# Altium project umay.PrjPcb
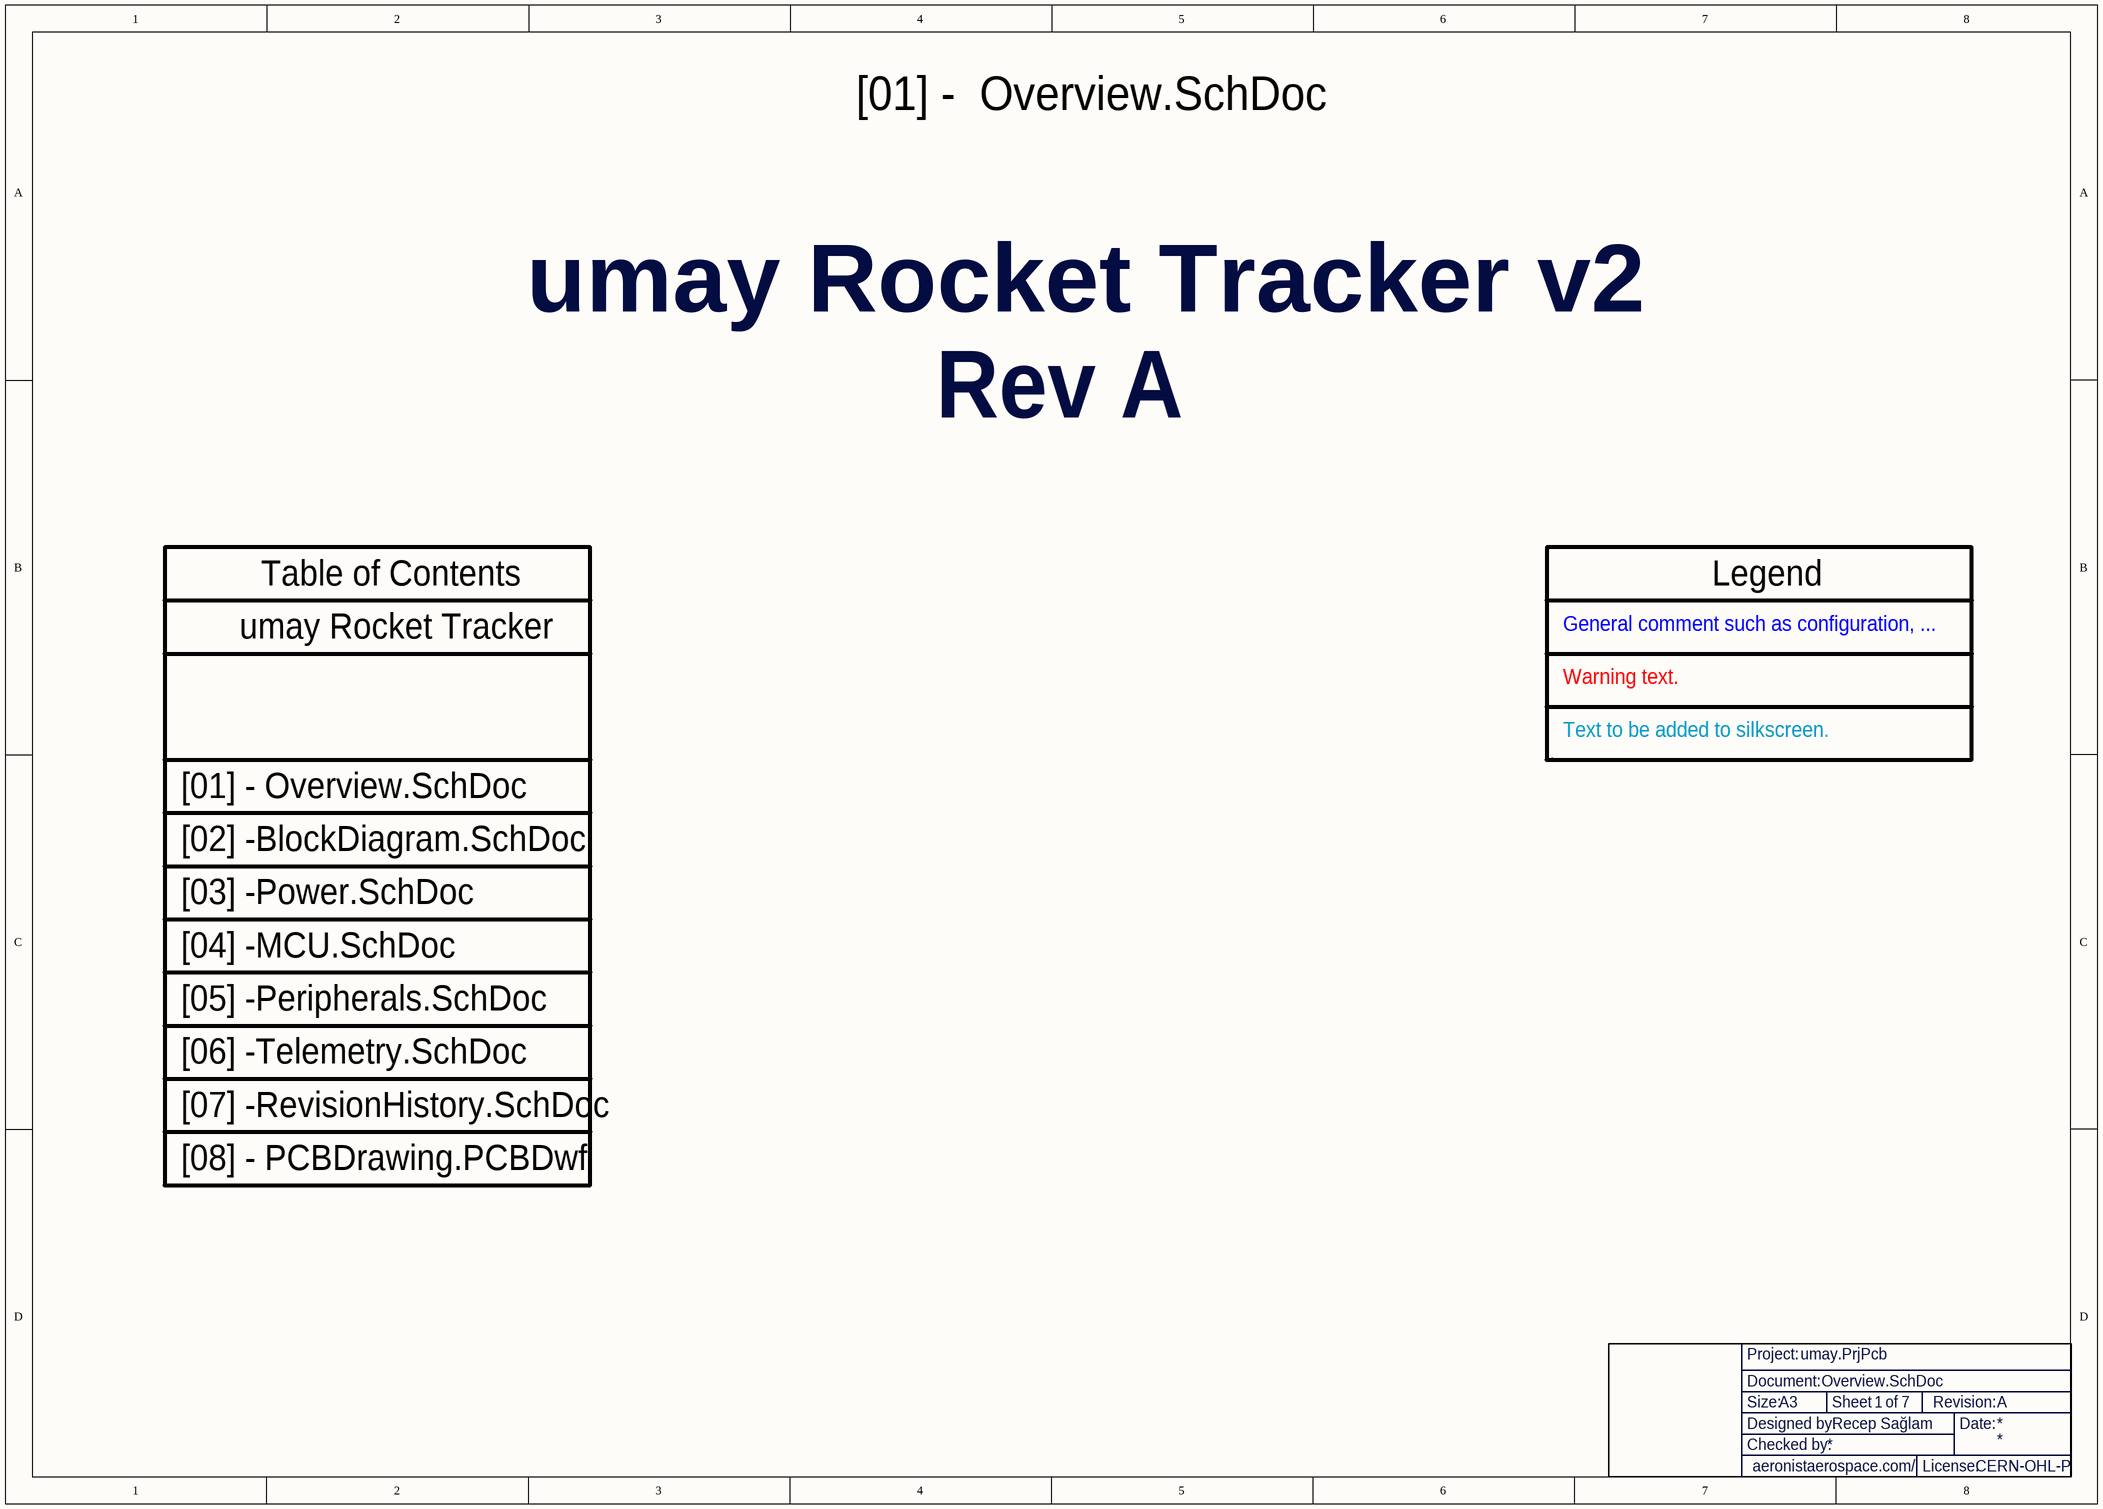
[diagram p0: Overview.SchDoc]
DesignedBy: Recep Sağlam; License: CERN-OHL-P; Revision: A; Size: A3
7 sheets, 115 parts. Net scope: flat (ports and power ports of the same name join across sheets).
Board file: umay.PcbDoc
Sheets:
  Overview.SchDoc
    MCU = MCU.SchDoc
    Peripherals = Peripherals.SchDoc
    Power = Power.SchDoc
    Telemetry = Telemetry.SchDoc
    Designator = BlockDiagram.SchDoc
    Designator = RevisionHistory.SchDoc

## Sheet Overview.SchDoc
size A3; SheetNumber: 1; SheetTotal: 7

### Parts
(Parts that share a designator on the sheet are numbered #1, #2 ... from top to bottom, then left to right.)
?#1  Title Block  (value not drawn)  (graphical)

### Sub-sheets
Designator = BlockDiagram.SchDoc: no entries
Designator = RevisionHistory.SchDoc: no entries
MCU = MCU.SchDoc: no entries
Peripherals = Peripherals.SchDoc: no entries
Power = Power.SchDoc: no entries
Telemetry = Telemetry.SchDoc: no entries

### Notes on the sheet
- [01] -  Overview.SchDoc
- umay Rocket Tracker v2
- Rev A
- umay Rocket Tracker
- Table of Contents
- General comment such as configuration, ...
- Legend
- Warning text.
- Text to be added to silkscreen.
- [01] - Overview.SchDoc
- [02] -
- [03] -
- [04] -
- [05] -
- [06] -
- [07] -
- [08] - PCBDrawing.PCBDwf
- (in symbol Title Block) Project:; Document:; Size:; Sheet; of; Revision:; Designed by:; Date:; Checked by:; aeronistaerospace.com/; License:

## Sheet MCU.SchDoc
size A3; SheetNumber: 4; SheetTotal: 7
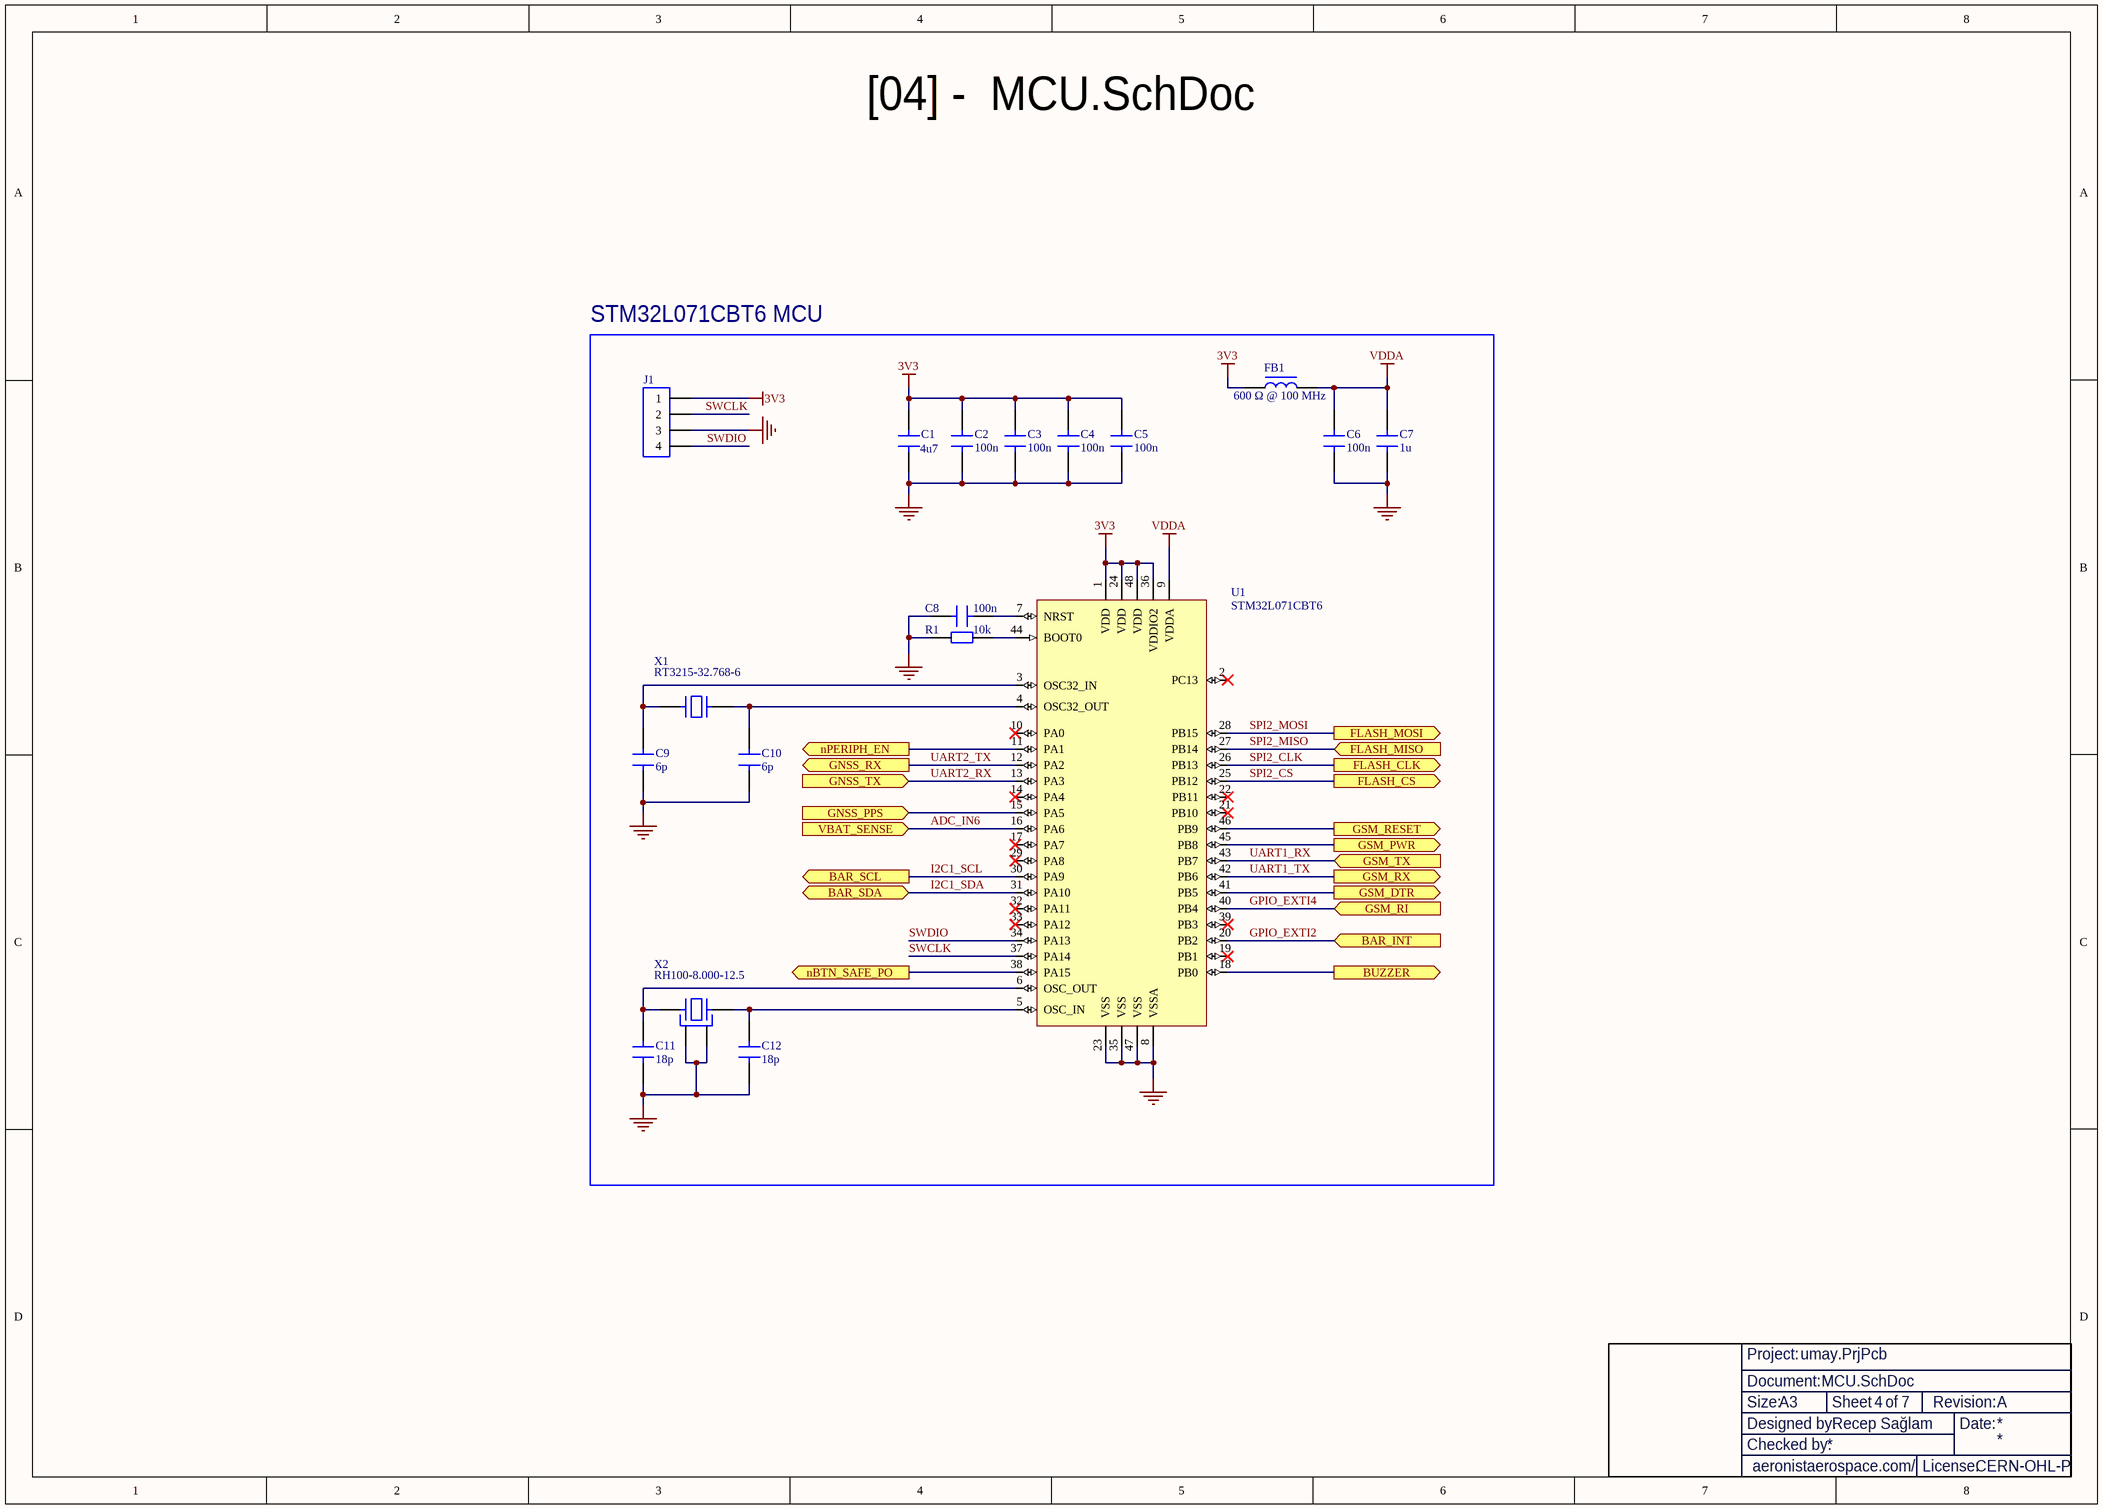
[diagram p1: MCU.SchDoc]

### Parts
(Parts that share a designator on the sheet are numbered #1, #2 ... from top to bottom, then left to right.)
?#2  Title Block  (value not drawn)  (graphical)
C1  4u7  [CAP 0603]
C2  100n  [CAP 0402]
C3  100n  [CAP 0402]
C4  100n  [CAP 0402]
C5  100n  [CAP 0402]
C6  100n  [CAP 0402]
C7  1u  [CAP 0603]
C8  100n  [CAP 0402]
C9  6p  [CAP 0402]
C10  6p  [CAP 0402]
C11  18p  [CAP 0402]
C12  18p  [CAP 0402]
FB1  600 Ω @ 100 MHz  [FB 0402]
J1  CONN 1x4 Pad 1.27mm  [CONN 1x4 PAD 1.27mm]  (value not drawn)
R1  10k  [RES 0402]
U1  STM32L071CBT6  [LQFP48]
X1  RT3215-32.768-6  [RT3215-32.768-X]
X2  RH100-8.000-12.5  [RH100]

### Blocks framed on the sheet
STM32L071CBT6 MCU: C1-C12 FB1 J1 R1 U1 X1 X2

### Ports
BAR_INT (in, see Peripherals[2C]), BAR_SCL (out, see Peripherals[4C]), BAR_SDA (bidir, see Peripherals[4C]), BUZZER (out, see Peripherals[5C]), FLASH_CLK (out, see Peripherals[5B]), FLASH_CS (out, see Peripherals[5B]), FLASH_MISO (in, see Peripherals[5B]), FLASH_MOSI (out, see Peripherals[5B]), GNSS_PPS (in, see Peripherals[3B]), GNSS_RX (out, see Peripherals[3B]), GNSS_TX (in, see Peripherals[3B]), GSM_DTR (out, see Telemetry[5D]), GSM_PWR (out, see Telemetry[5B]), GSM_RESET (out, see Telemetry[5C]), GSM_RI (in, see Telemetry[5D]), GSM_RX (out, see Telemetry[5D]), GSM_TX (in, see Telemetry[5D]), nBTN_SAFE_PO (out, see Telemetry[4C]), nPERIPH_EN (out, see Power[7C]), VBAT_SENSE (in, see Power[5C])

### Nets
3V3: C1.2 C2.2 C3.2 C4.2 C5.2 FB1.2 J1.1 U1.1(VDD) U1.24(VDD) U1.36(VDDIO2) U1.48(VDD)
GND: C1.1 C2.1 C3.1 C4.1 C5.1 C6.1 C7.1 C8.2 C9.1 C10.1 C11.1 C12.1 J1.3 R1.2 U1.8(VSSA) U1.23(VSS) U1.35(VSS) U1.47(VSS) X2.2(GND) X2.4(GND)
VDDA: C6.2 C7.2 FB1.1 U1.9(VDDA)
ADC_IN6: U1.16(PA6) ; port VBAT_SENSE
GNSS_PPS: U1.15(PA5) ; port GNSS_PPS
GPIO_EXTI2: U1.20(PB2) ; port BAR_INT
GPIO_EXTI4: U1.40(PB4) ; port GSM_RI
I2C1_SCL: U1.30(PA9) ; port BAR_SCL
I2C1_SDA: U1.31(PA10) ; port BAR_SDA
SPI2_CLK: U1.26(PB13) ; port FLASH_CLK
SPI2_CS: U1.25(PB12) ; port FLASH_CS
SPI2_MISO: U1.27(PB14) ; port FLASH_MISO
SPI2_MOSI: U1.28(PB15) ; port FLASH_MOSI
SWCLK: J1.2 U1.37(PA14)
SWDIO: J1.4 U1.34(PA13)
UART1_RX: U1.43(PB7) ; port GSM_TX
UART1_TX: U1.42(PB6) ; port GSM_RX
UART2_RX: U1.13(PA3) ; port GNSS_TX
UART2_TX: U1.12(PA2) ; port GNSS_RX
NetC8_1: C8.1 U1.7(NRST)
NetC9_2: C9.2 U1.3(OSC32_IN) X1.1
NetC10_2: C10.2 U1.4(OSC32_OUT) X1.2
NetC11_2: C11.2 U1.6(OSC_OUT) X2.1
NetC12_2: C12.2 U1.5(OSC_IN) X2.3
NetC13_1: U1.38(PA15) ; port nBTN_SAFE_PO
NetR1_1: R1.1 U1.44(BOOT0)
NetR7_2: U1.18(PB0) ; port BUZZER
NetR16_2: U1.45(PB8) ; port GSM_PWR
NetR19_2: U1.46(PB9) ; port GSM_RESET
NetR28_1: U1.11(PA1) ; port nPERIPH_EN
NetU1_41: U1.41(PB5) ; port GSM_DTR

Not connected (* = marked no-connect by the designer): U1 2(PC13)* 10(PA0)* 14(PA4)* 17(PA7)* 19(PB1)* 21(PB10)* 22(PB11)* 29(PA8)* 32(PA11)* 33(PA12)* 39(PB3)*

### Notes on the sheet
- [04] -  MCU.SchDoc
- (in symbol Title Block) Project:; Document:; Size:; Sheet; of; Revision:; Designed by:; Date:; Checked by:; aeronistaerospace.com/; License:

### Library data of the parts
C1 C7 = CAP 0603: Capacitor SMD 0603
C2-C6 C8-C12 = CAP 0402: Capacitor SMD 0402
FB1 = FB 0402: Ferrite Bead SMD 0402
J1 = CONN 1x4 Pad 1.27mm: 1×4 pin header connector, 1.27 mm pitch.
R1 = RES 0402: Resistor SMD 0402
U1 = STM32L071CBT6: MCU 32-Bit Ultra Low Power STM32L ARM Cortex M0+ RISC 128kB Flash 48-Pin LQFP Tray; Manufacturer: STMicroelectronics; Core Architecture: ARM Cortex-M0+; Data Bus Width: 32b; EEPROM Memory Size: 6kB; Frequency: 32MHz; Interface: I2S; Max Junction Temperature (Tj): 105°C; Max Power Dissipation: 370mW; Max Supply Voltage: 3.6V; Min Supply Voltage: 1.65V; Nominal Supply Current: 290nA; Number of A/D Converters: 1; Number of ADC Channels: 13; Number of Channels: 10; Number of I2C Channels: 2; Number of I/Os: 37; Number of PWM Channels: 4; Number of Timers/Counters: 8; Operating Supply Voltage: 3V; Peripherals: POR; RAM Size: 20kB; Watchdog Timer: Yes; Supplier: Farnell; Supplier Part Number: 2518142; Manufacturer Part Number: STM32L071CBT6; RoHS: Compliant; Category: Microcontrollers; Stock: 10105; Pricing: 1=3,31, 10=2,59, 25=2,41, 50=2,29, 100=2,07, 250=1,97, 500=1,9, 1000=1,74 (EUR); Ambient Temperature Range High: 85°C; Case/Package: LQFP; China RoHS: Compliant; Flash Memory Size: 128kB; Height: 1.6mm; Height - Seated (Max): 1.6mm; Lead Free: Lead Free; Length: 7mm; Lifecycle Status: Production; Clock Frequency: 32MHz; Max Operating Temperature: 85°C; Memory Size: 128kB; Memory Format: FLASH; Min Operating Temperature: -40°C; Mounting Technology: Surface Mount; Pins: 48; Number of Programmable I/O: 37; Number of SPI Channels: 2; Number of Terminals: 48; Number of UART Channels: 1; Number of USART Channels: 4; REACH SVHC: Yes; Schedule B: 8542310000; Terminal Pitch: 500µm; Width: 7mm; ComponentLink1URL: https://datasheet.octopart.com:443/STM32L071CBT6-STMicroelectronics-datasheet-137481386.pdf?src-supplier=IHS; ComponentLink1Description: https://datasheet.octopart.com:443/STM32L071CBT6-STMicroelectronics-datasheet-137481386.pdf?src-supplier=IHS; ComponentLink2URL: https://datasheet.octopart.com:443/STM32L071CBT6-STMicroelectronics-datasheet-113139635.pdf?src-supplier=ODG+(Origin+Data+Global); ComponentLink2Description: https://datasheet.octopart.com:443/STM32L071CBT6-STMicroelectronics-datasheet-113139635.pdf?src-supplier=ODG+(Origin+Data+Global); ComponentLink3URL: https://datasheet.octopart.com:443/STM32L071CBT6-STMicroelectronics-datasheet-62336796.pdf?src-supplier=SHENGYU+ELECTRONICS; ComponentLink3Description: https://datasheet.octopart.com:443/STM32L071CBT6-STMicroelectronics-datasheet-62336796.pdf?src-supplier=SHENGYU+ELECTRONICS; ComponentLink4URL: https://datasheet.octopart.com:443/STM32L071CBT6-STMicroelectronics-datasheet-49624918.pdf?src-supplier=Newark; ComponentLink4Description: https://datasheet.octopart.com:443/STM32L071CBT6-STMicroelectronics-datasheet-49624918.pdf?src-supplier=Newark
X1 = RT3215-32.768-X: Parallel - Fundamental Quartz Crystal, 0.032768MHz Nom; Manufacturer: Raltron Electronics; Manufacturer Part Number: RT3215-32.768-12.5-TR; Manufacturer Lifecycle Status: ACTIVE; Value: 12.5pF; Frequency: 32.768kHz; Frequency Stability: 144ppm; Frequency Tolerance: 0.002%; ESR: 70kΩ; Supplier: Arrow Electronics; Supplier Part Number: RT3215-32.768-12.5-TR; RoHS: Compliant; Category: Crystals; Stock: 108000; Pricing: 3000=0,2828, 6000=0,28, 9000=0,276, 15000=0,188, 21000=0,154, 30000=0,152 (USD); China RoHS: Compliant; Lead Free: Lead Free; Lifecycle Status: Production; Load Capacitance: 12.5pF; Max Operating Temperature: 85°C; Min Operating Temperature: -40°C; Mounting Technology: Surface Mount; REACH SVHC: Yes; Schedule B: 8541600080, 8541600080|8541600080|8541600080|8541600080|8541600080; Tolerance: 0.002%; ComponentLink1URL: https://datasheet.octopart.com:443/RT3215-32.768-12.5-TR-Raltron-Electronics-datasheet-181182521.pdf?src-supplier=IHS; ComponentLink1Description: https://datasheet.octopart.com:443/RT3215-32.768-12.5-TR-Raltron-Electronics-datasheet-181182521.pdf?src-supplier=IHS; ComponentLink2URL: https://datasheet.octopart.com:443/RT3215-32.768-12.5-TR-Raltron-Electronics-datasheet-140255155.pdf?src-supplier=Raltron+Electronics; ComponentLink2Description: https://datasheet.octopart.com:443/RT3215-32.768-12.5-TR-Raltron-Electronics-datasheet-140255155.pdf?src-supplier=Raltron+Electronics; ComponentLink3URL: https://datasheet.octopart.com:443/RT3215-32.768-12.5-TR-Raltron-Electronics-datasheet-137126748.pdf?src-supplier=Future+Electronics; ComponentLink3Description: https://datasheet.octopart.com:443/RT3215-32.768-12.5-TR-Raltron-Electronics-datasheet-137126748.pdf?src-supplier=Future+Electronics; ComponentLink4URL: https://datasheet.octopart.com:443/RT3215-32.768-12.5-TR-Raltron-Electronics-datasheet-82614827.pdf?src-supplier=Future+Electronics; ComponentLink4Description: https://datasheet.octopart.com:443/RT3215-32.768-12.5-TR-Raltron-Electronics-datasheet-82614827.pdf?src-supplier=Future+Electronics; ComponentLink5URL: https://datasheet.octopart.com:443/RT3215-32.768-12.5-TR-Raltron-Electronics-datasheet-62112304.pdf?src-supplier=Future+Electronics; ComponentLink5Description: https://datasheet.octopart.com:443/RT3215-32.768-12.5-TR-Raltron-Electronics-datasheet-62112304.pdf?src-supplier=Future+Electronics; ComponentLink6URL: https://datasheet.octopart.com:443/RT3215-32.768-12.5-TR-Raltron-Electronics-datasheet-12522443.pdf?src-supplier=Future+Electronics; ComponentLink6Description: https://datasheet.octopart.com:443/RT3215-32.768-12.5-TR-Raltron-Electronics-datasheet-12522443.pdf?src-supplier=Future+Electronics
X2 = RH100-X-X: RH100 Series Crystal, X Mhz, X pF, Smd, 3.2Mm X 2.5Mm Raltron

## Sheet Peripherals.SchDoc
size A3; SheetNumber: 5; SheetTotal: 7
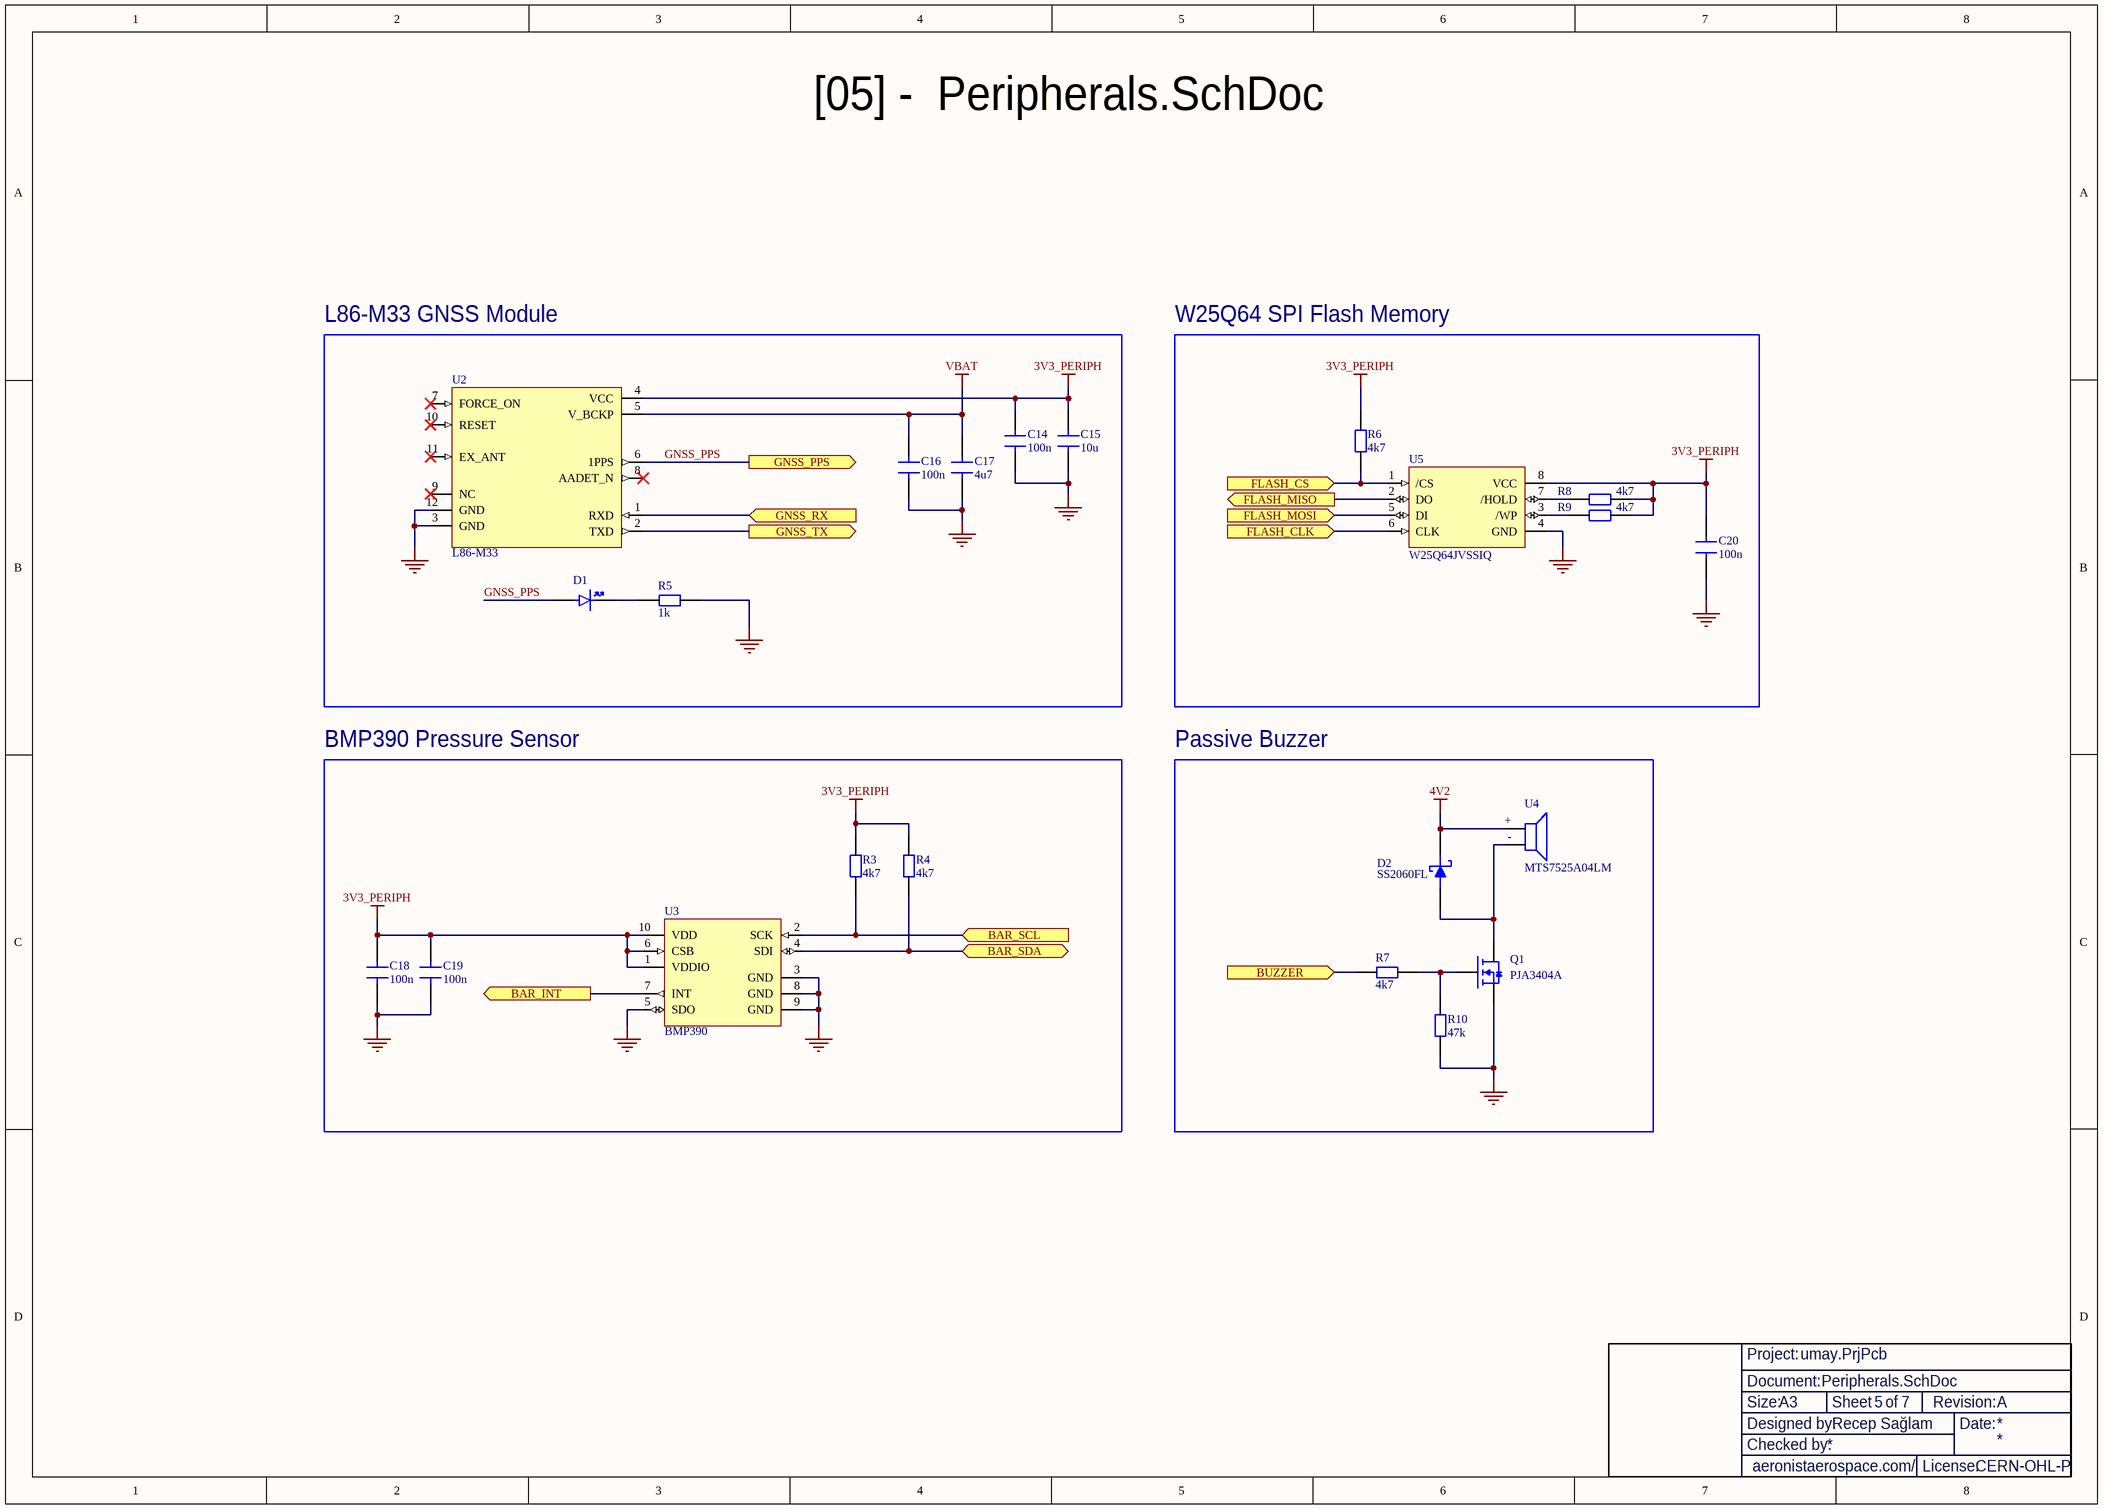
[diagram p2: Peripherals.SchDoc]

### Parts
(Parts that share a designator on the sheet are numbered #1, #2 ... from top to bottom, then left to right.)
?#3  Title Block  (value not drawn)  (graphical)
C14  100n  [CAP 0402]
C15  10u  [CAP 0603]
C16  100n  [CAP 0402]
C17  4u7  [CAP 0603]
C18  100n  [CAP 0402]
C19  100n  [CAP 0402]
C20  100n  [CAP 0402]
D1  LED 0805  [LED 0805]  (value not drawn)
D2  SS2060FL  [SOD-123FL]
Q1  PJA3404A  [SOT23-3]
R3  4k7  [RES 0402]
R4  4k7  [RES 0402]
R5  1k  [RES 0402]
R6  4k7  [RES 0402]
R7  4k7  [RES 0402]
R8  4k7  [RES 0402]
R9  4k7  [RES 0402]
R10  47k  [RES 0402]
U2  L86-M33  [L86-M33]
U3  BMP390  [BMP390]
U4  MTS7525A04LM  [MTS7525A04LM]
U5  W25Q64JVSSIQ  [SOP-8]

### Blocks framed on the sheet
L86-M33 GNSS Module: C14-C17 D1 R5 U2
W25Q64 SPI Flash Memory: C20 R6 R8 R9 U5
BMP390 Pressure Sensor: C18 C19 R3 R4 U3
Passive Buzzer: D2 Q1 R7 R10 U4

### Ports
BAR_INT (out, see MCU[6C]), BAR_SCL (in, see MCU[4C]), BAR_SDA (bidir, see MCU[4C]), BUZZER (in, see MCU[6C]), FLASH_CLK (in, see MCU[6C]), FLASH_CS (in, see MCU[6C]), FLASH_MISO (out, see MCU[6B]), FLASH_MOSI (in, see MCU[6B]), GNSS_PPS (out, see MCU[4C]), GNSS_RX (in, see MCU[4C]), GNSS_TX (out, see MCU[4C])

### Nets
3V3_PERIPH: C14.2 C15.2 C18.2 C19.2 C20.2 R3.2 R4.2 R6.1 R8.2 R9.2 U2.4(VCC) U3.1(VDDIO) U3.6(CSB) U3.10(VDD) U5.8(VCC)
4V2: D2.2 U4.+
GND: C14.1 C15.1 C16.1 C17.1 C18.1 C19.1 C20.1 Q1.2(S) R5.2 R10.1 U2.3(GND) U2.12(GND) U3.3(GND) U3.5(SDO) U3.8(GND) U3.9(GND) U5.4(GND)
VBAT: C16.2 C17.2 U2.5(V_BCKP)
GNSS_PPS: D1.A U2.6(1PPS) ; port GNSS_PPS
GPIO_EXTI2: U3.7(INT) ; port BAR_INT
I2C1_SCL: R3.1 U3.2(SCK) ; port BAR_SCL
I2C1_SDA: R4.1 U3.4(SDI) ; port BAR_SDA
SPI2_CLK: U5.6(CLK) ; port FLASH_CLK
SPI2_CS: R6.2 U5.1(/CS) ; port FLASH_CS
SPI2_MISO: U5.2(DO) ; port FLASH_MISO
SPI2_MOSI: U5.5(DI) ; port FLASH_MOSI
UART2_RX: U2.2(TXD) ; port GNSS_TX
UART2_TX: U2.1(RXD) ; port GNSS_RX
NetD1_K: D1.K R5.1
NetD2_1: D2.1 Q1.3(D) U4.-
NetQ1_1: Q1.1(G) R7.1 R10.2
NetR7_2: R7.2 ; port BUZZER
NetR8_1: R8.1 U5.7(/HOLD)
NetR9_1: R9.1 U5.3(/WP)

Not connected (* = marked no-connect by the designer): U2 7(FORCE_ON)* 8(AADET_N)* 9(NC)* 10(RESET)* 11(EX_ANT)*

### Notes on the sheet
- [05] -  Peripherals.SchDoc
- (in symbol Title Block) Project:; Document:; Size:; Sheet; of; Revision:; Designed by:; Date:; Checked by:; aeronistaerospace.com/; License:

### Library data of the parts
C14 C16 C18-C20 = CAP 0402: Capacitor SMD 0402
C15 C17 = CAP 0603: Capacitor SMD 0603
D1 = LED 0805: LED 0805 SMD
D2 = SS2060FL: Rectifier Diode, Schottky, 1 Phase, 1 Element, 2A, 60V V(RRM), Silicon; Manufacturer: Panjit; Manufacturer Part Number: SS2060FL_R1_00001; Element Configuration: Single; Forward Voltage: 700mV; Max Forward Surge Current (Ifsm): 50A; Number of Elements: 1; Peak Reverse Current: 40µA; Supplier: Mouser; Supplier Part Number: 241-SS2060FLR100001; RoHS: Compliant; Category: Rectifier Diodes; Stock: 5102; Pricing: 1=0,36, 10=0,232, 50=0,232, 100=0,161, 1000=0,107, 10000=0,067 (USD); Lifecycle Status: Production; Max Operating Temperature: 150°C; Max Output current: 2A; Max Repetitive Reverse Voltage (Vrrm): 60V; Min Operating Temperature: -50°C; Mounting Technology: Surface Mount; Pins: 2; Number of Terminals: 2; Peak Non-Repetitive Surge Current: 50A; Radiation Hardening: No; REACH SVHC: No; Reverse Standoff Voltage: 60V; ComponentLink1URL: https://datasheet.octopart.com:443/SS2060FL_R1_00001-Panjit-datasheet-151294498.pdf?src-supplier=IHS; ComponentLink1Description: https://datasheet.octopart.com:443/SS2060FL_R1_00001-Panjit-datasheet-151294498.pdf?src-supplier=IHS; ComponentLink2URL: https://datasheet.octopart.com:443/SS2060FL_R1_00001-Panjit-datasheet-180983485.pdf?src-supplier=IHS; ComponentLink2Description: https://datasheet.octopart.com:443/SS2060FL_R1_00001-Panjit-datasheet-180983485.pdf?src-supplier=IHS
Q1 = MOSFET N-CH: SOT-23-3 package, N-Channel MOSFET
R3-R10 = RES 0402: Resistor SMD 0402
U2 = L86-M33: GNSS Module, Galileo, GLONASS, GPS, QZSS, 1.57542GHz, 1.60171GHz, -167 dBm, 35 s, 3V to 4.3V; Manufacturer: Quectel; Number of Circuits: 1; Operating Supply Voltage: 3.3V; Supplier: Mouser; Supplier Part Number: 277-L86-M33; Manufacturer Part Number: L86-M33; RoHS: Compliant; Category: RF Transceiver Modules and Modems; Stock: 1427; Pricing: 1=12,82, 10=11,15, 50=10,56, 100=9,77, 1000=8,75, 10000=8,75 (USD); Height - Seated (Max): 7.15mm; Length: 18.4mm; Max Operating Temperature: 85°C; Min Operating Temperature: -40°C; Number of Terminals: 12; REACH SVHC: Yes; Width: 18.4mm; ComponentLink1URL: https://datasheet.octopart.com:443/L86-M33-Quectel-datasheet-181153375.pdf?src-supplier=IHS; ComponentLink1Description: https://datasheet.octopart.com:443/L86-M33-Quectel-datasheet-181153375.pdf?src-supplier=IHS; ComponentLink2URL: https://datasheet.octopart.com:443/L86-M33-Quectel-datasheet-163887215.pdf?src-supplier=SOS+electronic; ComponentLink2Description: https://datasheet.octopart.com:443/L86-M33-Quectel-datasheet-163887215.pdf?src-supplier=SOS+electronic; ComponentLink3URL: https://datasheet.octopart.com/L86-M33-Quectel-datasheet-77840748.pdf; ComponentLink3Description: https://datasheet.octopart.com/L86-M33-Quectel-datasheet-77840748.pdf
U3 = BMP390: Pressure sensor, 300-1250hPa, 2.0*2.0*0.75mm, I2C/SPI; Manufacturer: Bosch Sensortec; Supplier: Future Electronics; Supplier Part Number: 3151950; Manufacturer Part Number: BMP390; RoHS: Compliant; Category: Pressure Sensors; Stock: 106; Pricing: 1=3,29, 20=3,01, 150=2,83, 1000=2,65, 5000=2,5 (USD); ComponentLink1URL: https://datasheet.octopart.com:443/BMP390-Bosch-Sensortec-datasheet-164327956.pdf?src-supplier=Future+Electronics; ComponentLink1Description: https://datasheet.octopart.com:443/BMP390-Bosch-Sensortec-datasheet-164327956.pdf?src-supplier=Future+Electronics
U4 = MTS7525A04LM: 7.5 x 7.5 mm magnetic passive buzzer, SMT, 3.6 V (2.5–4.5 V), 2.7 kHz, 85 dB.
U5 = W25Q64JVSSIQ: NOR Flash Serial (SPI, Dual SPI, Quad SPI) 3V/3.3V 64M-bit 8M x 8 6ns 8-Pin SOIC T/R/Tray/Tube; Manufacturer: Winbond; Address Bus Width: 24b; Density: 512Mb; Frequency: 133MHz; Max Supply Current: 18mA; Max Supply Voltage: 3.6V; Memory Size: 8MB; Min Supply Voltage: 2.7V; Number of Circuits: 1; Operating Supply Voltage: 3V; Page Size: 256B; Supplier: Arrow Electronics; Supplier Part Number: W25Q64JVSSIQ; Manufacturer Part Number: W25Q64JVSSIQ; RoHS: Compliant; Category: Flash; Stock: 305; Pricing: 90=0,8058, 180=0,804, 270=0,785 (USD); Access Time: 6ns; Ambient Temperature Range High: 85°C; Case/Package: SOIC; China RoHS: Compliant; Height: 2.16mm; Height - Seated (Max): 2.16mm; Interface: Serial; Length: 5.23mm; Lifecycle Status: Production; Clock Frequency: 133MHz; Max Operating Temperature: 85°C; Memory Format: FLASH; Min Operating Temperature: -40°C; Mounting Technology: Surface Mount; Pins: 8; Number of Terminals: 8; REACH SVHC: Yes; Schedule B: 8542320070, 8542320070|8542320070, 8542320070|8542320070|8542320070, 8542320070|8542320070|8542320070|8542320070; Terminal Pitch: 1.27mm; Width: 5.23mm; ComponentLink1URL: https://datasheet.octopart.com:443/W25Q64JVSSIQ-Winbond-datasheet-179437472.pdf?src-supplier=IHS; ComponentLink1Description: https://datasheet.octopart.com:443/W25Q64JVSSIQ-Winbond-datasheet-179437472.pdf?src-supplier=IHS; ComponentLink2URL: https://datasheet.octopart.com:443/W25Q64JVSSIQ-Winbond-datasheet-138898694.pdf?src-supplier=ODG+(Origin+Data+Global); ComponentLink2Description: https://datasheet.octopart.com:443/W25Q64JVSSIQ-Winbond-datasheet-138898694.pdf?src-supplier=ODG+(Origin+Data+Global); ComponentLink3URL: https://sigma.octopart.com:443/138898685/technical_drawing/Winbond-W25Q64JVSSIQ.pdf?src-supplier=Upverter; ComponentLink3Description: https://sigma.octopart.com:443/138898685/technical_drawing/Winbond-W25Q64JVSSIQ.pdf?src-supplier=Upverter

## Sheet Power.SchDoc
size A3; SheetNumber: 3; SheetTotal: 7
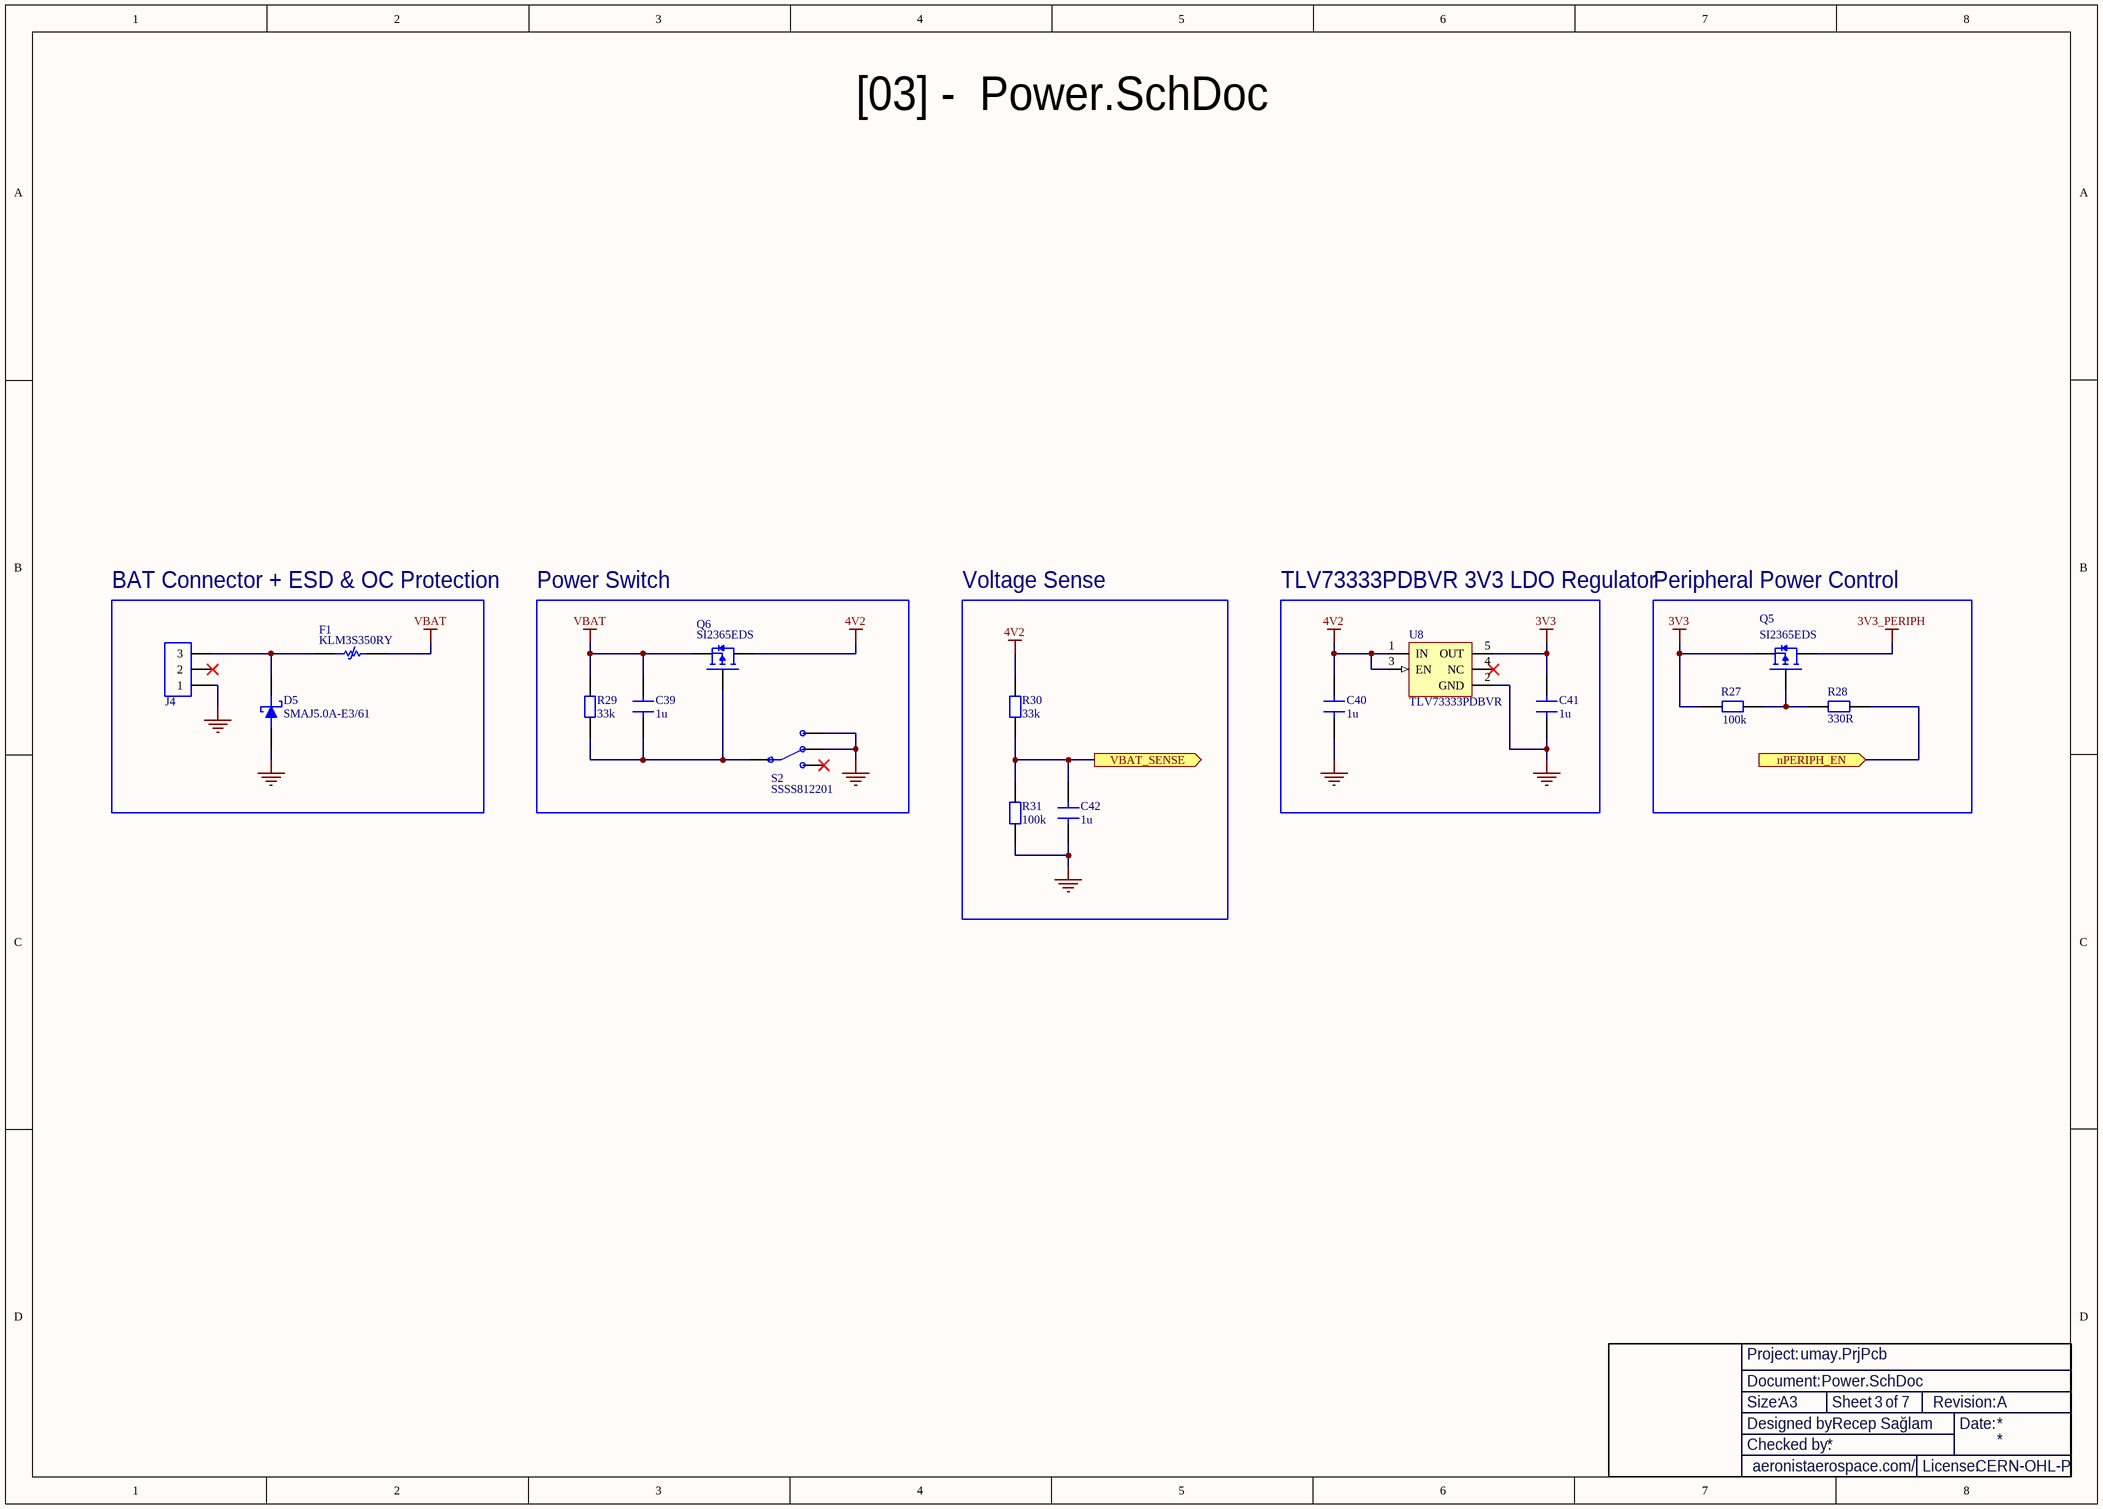
[diagram p3: Power.SchDoc]

### Parts
(Parts that share a designator on the sheet are numbered #1, #2 ... from top to bottom, then left to right.)
?#4  Title Block  (value not drawn)  (graphical)
C39  1u  [CAP 0603]
C40  1u  [CAP 0603]
C41  1u  [CAP 0603]
C42  1u  [CAP 0603]
D5  SMAJ5.0A-E3/61  [SMA]
F1  KLM3S350RY  [PTC 1206]
J4  CONN 1x3 Micro Fit 3.00mm  [CONN 1X3 MICRO-FIT 3.00MM]  (value not drawn)
Q5  SI2365EDS  [SOT23-3]
Q6  SI2365EDS  [SOT23-3]
R27  100k  [RES 0402]
R28  330R  [RES 0402]
R29  33k  [RES 0402]
R30  33k  [RES 0402]
R31  100k  [RES 0402]
S2  SSSS812201  [SSSS812201]
U8  TLV73333PDBVR  [SOT23-5]

### Blocks framed on the sheet
BAT Connector + ESD & OC Protection: D5 F1 J4
Power Switch: C39 Q6 R29 S2
Voltage Sense: C42 R30 R31
TLV73333PDBVR 3V3 LDO Regulator: C40 C41 U8
Peripheral Power Control: Q5 R27 R28

### Ports
nPERIPH_EN (in, see MCU[4B]), VBAT_SENSE (out, see MCU[4C])

### Nets
3V3: C41.2 Q5.2(S) R27.2 U8.5(OUT)
3V3_PERIPH: Q5.3(D)
4V2: C40.2 Q6.3(D) R30.2 U8.1(IN) U8.3(EN)
GND: C40.1 C41.1 C42.1 D5.1 J4.1 R31.1 S2.1(NO) S2.2(NC) U8.2(GND)
VBAT: C39.2 F1.2 Q6.2(S) R29.2
ADC_IN6: C42.2 R30.1 R31.2 ; port VBAT_SENSE
NetC39_1: C39.1 Q6.1(G) R29.1 S2.3(C)
NetD5_2: D5.2 F1.1 J4.3
NetQ5_1: Q5.1(G) R27.1 R28.2
NetR28_1: R28.1 ; port nPERIPH_EN

Not connected (* = marked no-connect by the designer): J4 2*; S2 4(NO)*; U8 4(NC)*

### Notes on the sheet
- [03] -  Power.SchDoc
- (in symbol Title Block) Project:; Document:; Size:; Sheet; of; Revision:; Designed by:; Date:; Checked by:; aeronistaerospace.com/; License:

### Library data of the parts
C39-C42 = CAP 0603: Capacitor SMD 0603
D5 = SMAJ-X: SMAJ Series SMT Bi/Uni-Directional Transient Voltage Suppressor - SMA
F1 = PTC 1206: PTC Resettable Fuse; Manufacturer: Bel; Manufacturer Part Number: 0ZCG0075FF2C; Max Current Rating: 100A; Hold Current: 750mA; Trip Current: 1.5A; Time to Trip: 200ms; Supplier 1: Arrow Electronics; RoHS: Yes; Category: PTC Resettable Fuses; Stock 1: 4661; Pricing 1: 2000=0,0751, 4000=0,0699, 6000=0,065, 10000=0,0604 (USD); Mount: Surface Mount; Case/Package: 1812; Case Code (Metric): 4532; Case Code (Imperial): 1812; Contact Plating: Tin,Matte; Min Operating Temperature: -40°C; Max Operating Temperature: 85°C; Packaging: Cut Tape; Series: 0ZCG; Lead Free: Lead Free; RoHS Compliant: Yes; ComponentLink1URL: https://datasheet.ciiva.com/18550/0zcg-18550523.pdf?src-supplier=Digi-Key; ComponentLink1Description: https://datasheet.ciiva.com/18550/0zcg-18550523.pdf?src-supplier=Digi-Key; ComponentLink2URL: https://datasheet.ciiva.com/18550/0zcg-18550524.pdf?src-supplier=Digi-Key; ComponentLink2Description: https://datasheet.ciiva.com/18550/0zcg-18550524.pdf?src-supplier=Digi-Key; ComponentLink3URL: https://datasheet.ciiva.com/18550/0zcg-18550767.pdf?src-supplier=Digi-Key; ComponentLink3Description: https://datasheet.ciiva.com/18550/0zcg-18550767.pdf?src-supplier=Digi-Key
J4 = CONN 1x3 Micro Fit 3.00mm: 1×2 Micro Fit type connector, 3.0 mm pitch, surface-mount.
Q5 Q6 = MOSFET P-CH: SOT-23-3 package, P-Channel MOSFET
R27-R31 = RES 0402: Resistor SMD 0402
S2 = SSSS812201: Slide Switch / Switch Slide SP3T Side Slide 0.3A 5VDC 10000Cycles Gull Wing SMD T/R; Manufacturer: ALPS; Actuator Length: 1.4986mm; Contact Current Rating: 300mA; Contact Resistance: 70mΩ; Electrical Life: 10kcycles; Illumination Type: Non-Illuminated; Insulation Resistance: 100MΩ; Max Voltage Rating (DC): 4V; Number of Positions: 3; Operating Force: 2N; Voltage Rating (DC): 5V; Supplier: Mouser; Supplier Part Number: 688-SSSS812201; Manufacturer Part Number: SSSS812201; RoHS: Compliant; Category: Slide Switches; Stock: 3543; Pricing: 1=1,77, 10=1,6, 50=1,47, 100=1,34, 1000=0,852, 10000=0,851 (USD); Current Rating: 300mA; Depth: 5mm; Export Control Classification Number (ECCN) Code: EAR99; Height: 1.4mm; Harmonized Tariff Schedule (HTS) Code: 8536.50.90.50; Introduction Date: 2010-02-04; Length: 9.7mm; Lifecycle Status: Production; Max Current Rating: 300mA; Max Operating Temperature: 85°C; Mechanical Life: 10kcycles; Min Operating Temperature: -40°C; Mounting Technology: Surface Mount; Pins: 3; Orientation: Right Angle; Radiation Hardening: No; Termination: Gull Wing; Throw Configuration: SP3T; ComponentLink1URL: https://datasheet.octopart.com:443/SSSS812201-ALPS-datasheet-182235029.pdf?src-supplier=IHS; ComponentLink1Description: https://datasheet.octopart.com:443/SSSS812201-ALPS-datasheet-182235029.pdf?src-supplier=IHS; ComponentLink2URL: https://datasheet.octopart.com:443/SSSS812201-ALPS-datasheet-182235643.pdf?src-supplier=IHS; ComponentLink2Description: https://datasheet.octopart.com:443/SSSS812201-ALPS-datasheet-182235643.pdf?src-supplier=IHS; ComponentLink3URL: https://datasheet.octopart.com:443/SSSS812201-ALPS-datasheet-154726925.pdf?src-supplier=Electro+Sonic; ComponentLink3Description: https://datasheet.octopart.com:443/SSSS812201-ALPS-datasheet-154726925.pdf?src-supplier=Electro+Sonic; ComponentLink4URL: https://datasheet.octopart.com:443/SSSS812201-ALPS-datasheet-41175121.pdf?src-supplier=Electro+Sonic; ComponentLink4Description: https://datasheet.octopart.com:443/SSSS812201-ALPS-datasheet-41175121.pdf?src-supplier=Electro+Sonic; ComponentLink5URL: https://datasheet.octopart.com:443/SSSS812201-ALPS-datasheet-37145305.pdf?src-supplier=Electro+Sonic; ComponentLink5Description: https://datasheet.octopart.com:443/SSSS812201-ALPS-datasheet-37145305.pdf?src-supplier=Electro+Sonic; ComponentLink6URL: https://datasheet.octopart.com:443/SSSS812201-ALPS-datasheet-140497758.pdf?src-supplier=TME; ComponentLink6Description: https://datasheet.octopart.com:443/SSSS812201-ALPS-datasheet-140497758.pdf?src-supplier=TME
U8 = TLV73333PDBVR: 300-mA, capacitor-free, low-IQ, low-dropout voltage regulator with enable 5-SOT-23 -40 to 125; Manufacturer: Texas Instruments; Manufacturer Lifecycle Status: ACTIVE; Accuracy: 1%; Dropout Voltage: 125mV; Max Supply Voltage: 5.5V; Max Junction Temperature (Tj): 125°C; Max Output current: 300mA; Min Current Limit: 360mA; Min Input Voltage: 1.4V; Nominal Supply Current: 34µA; Number of Channels: 1; Output Type: Fixed; Output Voltage: 3.3V; Polarity: Positive; Quiescent Current: 60µA; Supplier: Mouser; Supplier Part Number: 595-TLV73333PDBVR; Manufacturer Part Number: TLV73333PDBVR; RoHS: Compliant; Category: LDO Voltage Regulators; Stock: 12067; Pricing: 1=0,17, 10=0,115, 50=0,101, 100=0,086, 1000=0,07, 10000=0,062 (USD); Case/Package: SOT-23; Contact Plating: Gold; Height: 1.45mm; Lead Free: Lead Free; Length: 2.9mm; Lifecycle Status: Production; Max Operating Temperature: 125°C; Min Operating Temperature: -40°C; Min Supply Voltage: 1.4V; Mounting Technology: Surface Mount; Number of Outputs: 1; Pins: 5; Number of Regulators: 1; Output Current: 300mA; Packaging: Tape & Reel; Radiation Hardening: No; Schedule B: 8542390000, 8542390000|8542390000|8542390000|8542390000|8542390000; Thickness: 1.2mm; Weight: 15.790684mg; Width: 1.6mm; ComponentLink1URL: https://sigma.octopart.com:443/177332311/technical_drawing/Texas-Instruments-TLV73333PDBVR.pdf?src-supplier=Texas+Instruments; ComponentLink1Description: https://sigma.octopart.com:443/177332311/technical_drawing/Texas-Instruments-TLV73333PDBVR.pdf?src-supplier=Texas+Instruments; ComponentLink2URL: https://octopart.com:443/opatz8j6/c1?t=30rxbCOKURE0fvLotVHr2--9yC-4hWgg0fjorl7QajC5RXkKBG22M4ZWLOTtqEVkHrkQWGSvUBCT4JzFCKRza57xxEH2AM5zMdrmzUF7HUn0SZ7VrBnq1qaBEhnASKZ9K6cpMGD6K96mHw2RuAXFnqi8r3hf25pr5WVy_93zC9DtrJ2-QNFvwlrZk1EXJAO4qYO9518NXgqDx2DdBm28by8vGuJzgOvU8mXkfRtT8k19nHvP1ZfIaADJPU6FeaqlEbd-j24xmPfxYt-FfVEHWXt0tW1yZYApp5WPtqSvL-aKGKcx1420oXKrzNb7imis-_kE6QqMT633l-x_OdY6nHSWd6_HrFJGfkvfwlphIUbgO9Y3y8pg3cXI5t7uujLqBDPZRvw&src-supplier=Texas+Instruments; ComponentLink2Description: https://octopart.com:443/opatz8j6/c1?t=30rxbCOKURE0fvLotVHr2--9yC-4hWgg0fjorl7QajC5RXkKBG22M4ZWLOTtqEVkHrkQWGSvUBCT4JzFCKRza57xxEH2AM5zMdrmzUF7HUn0SZ7VrBnq1qaBEhnASKZ9K6cpMGD6K96mHw2RuAXFnqi8r3hf25pr5WVy_93zC9DtrJ2-QNFvwlrZk1EXJAO4qYO9518NXgqDx2DdBm28by8vGuJzgOvU8mXkfRtT8k19nHvP1ZfIaADJPU6FeaqlEbd-j24xmPfxYt-FfVEHWXt0tW1yZYApp5WPtqSvL-aKGKcx1420oXKrzNb7imis-_kE6QqMT633l-x_OdY6nHSWd6_HrFJGfkvfwlphIUbgO9Y3y8pg3cXI5t7uujLqBDPZRvw&src-supplier=Texas+Instruments; ComponentLink3URL: https://sigma.octopart.com:443/175570406/technical_drawing/Texas-Instruments-TLV73333PDBVR.pdf?src-supplier=Texas+Instruments; ComponentLink3Description: https://sigma.octopart.com:443/175570406/technical_drawing/Texas-Instruments-TLV73333PDBVR.pdf?src-supplier=Texas+Instruments; ComponentLink4URL: https://sigma.octopart.com:443/169406034/technical_drawing/Texas-Instruments-TLV73333PDBVR.pdf?src-supplier=Texas+Instruments; ComponentLink4Description: https://sigma.octopart.com:443/169406034/technical_drawing/Texas-Instruments-TLV73333PDBVR.pdf?src-supplier=Texas+Instruments; ComponentLink5URL: https://sigma.octopart.com:443/155939316/technical_drawing/Texas-Instruments-TLV73333PDBVR.pdf?src-supplier=Texas+Instruments; ComponentLink5Description: https://sigma.octopart.com:443/155939316/technical_drawing/Texas-Instruments-TLV73333PDBVR.pdf?src-supplier=Texas+Instruments; ComponentLink6URL: https://sigma.octopart.com:443/102331370/technical_drawing/Texas-Instruments-TLV73333PDBVR.pdf?src-supplier=Texas+Instruments; ComponentLink6Description: https://sigma.octopart.com:443/102331370/technical_drawing/Texas-Instruments-TLV73333PDBVR.pdf?src-supplier=Texas+Instruments; ComponentLink7URL: https://datasheet.octopart.com:443/TLV73333PDBVR-Texas-Instruments-datasheet-37736395.pdf?src-supplier=Texas+Instruments; ComponentLink7Description: https://datasheet.octopart.com:443/TLV73333PDBVR-Texas-Instruments-datasheet-37736395.pdf?src-supplier=Texas+Instruments; ComponentLink8URL: https://datasheet.octopart.com:443/TLV73333PDBVR-Texas-Instruments-datasheet-34151877.pdf?src-supplier=Texas+Instruments; ComponentLink8Description: https://datasheet.octopart.com:443/TLV73333PDBVR-Texas-Instruments-datasheet-34151877.pdf?src-supplier=Texas+Instruments; ComponentLink9URL: https://sigma.octopart.com:443/49249325/technical_drawing/Texas-Instruments-TLV73333PDBVR.pdf?src-supplier=Texas+Instruments; ComponentLink9Description: https://sigma.octopart.com:443/49249325/technical_drawing/Texas-Instruments-TLV73333PDBVR.pdf?src-supplier=Texas+Instruments; ComponentLink10URL: https://datasheet.octopart.com:443/TLV73333PDBVR-Texas-Instruments-datasheet-32043788.pdf?src-supplier=Texas+Instruments; ComponentLink10Description: https://datasheet.octopart.com:443/TLV73333PDBVR-Texas-Instruments-datasheet-32043788.pdf?src-supplier=Texas+Instruments; ComponentLink11URL: https://datasheet.octopart.com:443/TLV73333PDBVR-Texas-Instruments-datasheet-159114894.pdf?src-supplier=Augswan; ComponentLink11Description: https://datasheet.octopart.com:443/TLV73333PDBVR-Texas-Instruments-datasheet-159114894.pdf?src-supplier=Augswan; ComponentLink12URL: https://datasheet.octopart.com:443/TLV73333PDBVR-Texas-Instruments-datasheet-159117831.pdf?src-supplier=LCSC; ComponentLink12Description: https://datasheet.octopart.com:443/TLV73333PDBVR-Texas-Instruments-datasheet-159117831.pdf?src-supplier=LCSC; ComponentLink13URL: http://sigma.octopart.com:80/conflict_mineral_statement/Texas-Instruments-company-63.pdf?src-supplier=Compliance+Statements; ComponentLink13Description: http://sigma.octopart.com:80/conflict_mineral_statement/Texas-Instruments-company-63.pdf?src-supplier=Compliance+Statements; ComponentLink14URL: http://sigma.octopart.com:80/reach_statement/Texas-Instruments-company-64.pdf?src-supplier=Compliance+Statements; ComponentLink14Description: http://sigma.octopart.com:80/reach_statement/Texas-Instruments-company-64.pdf?src-supplier=Compliance+Statements

## Sheet Telemetry.SchDoc
size A3; SheetNumber: 6; SheetTotal: 7
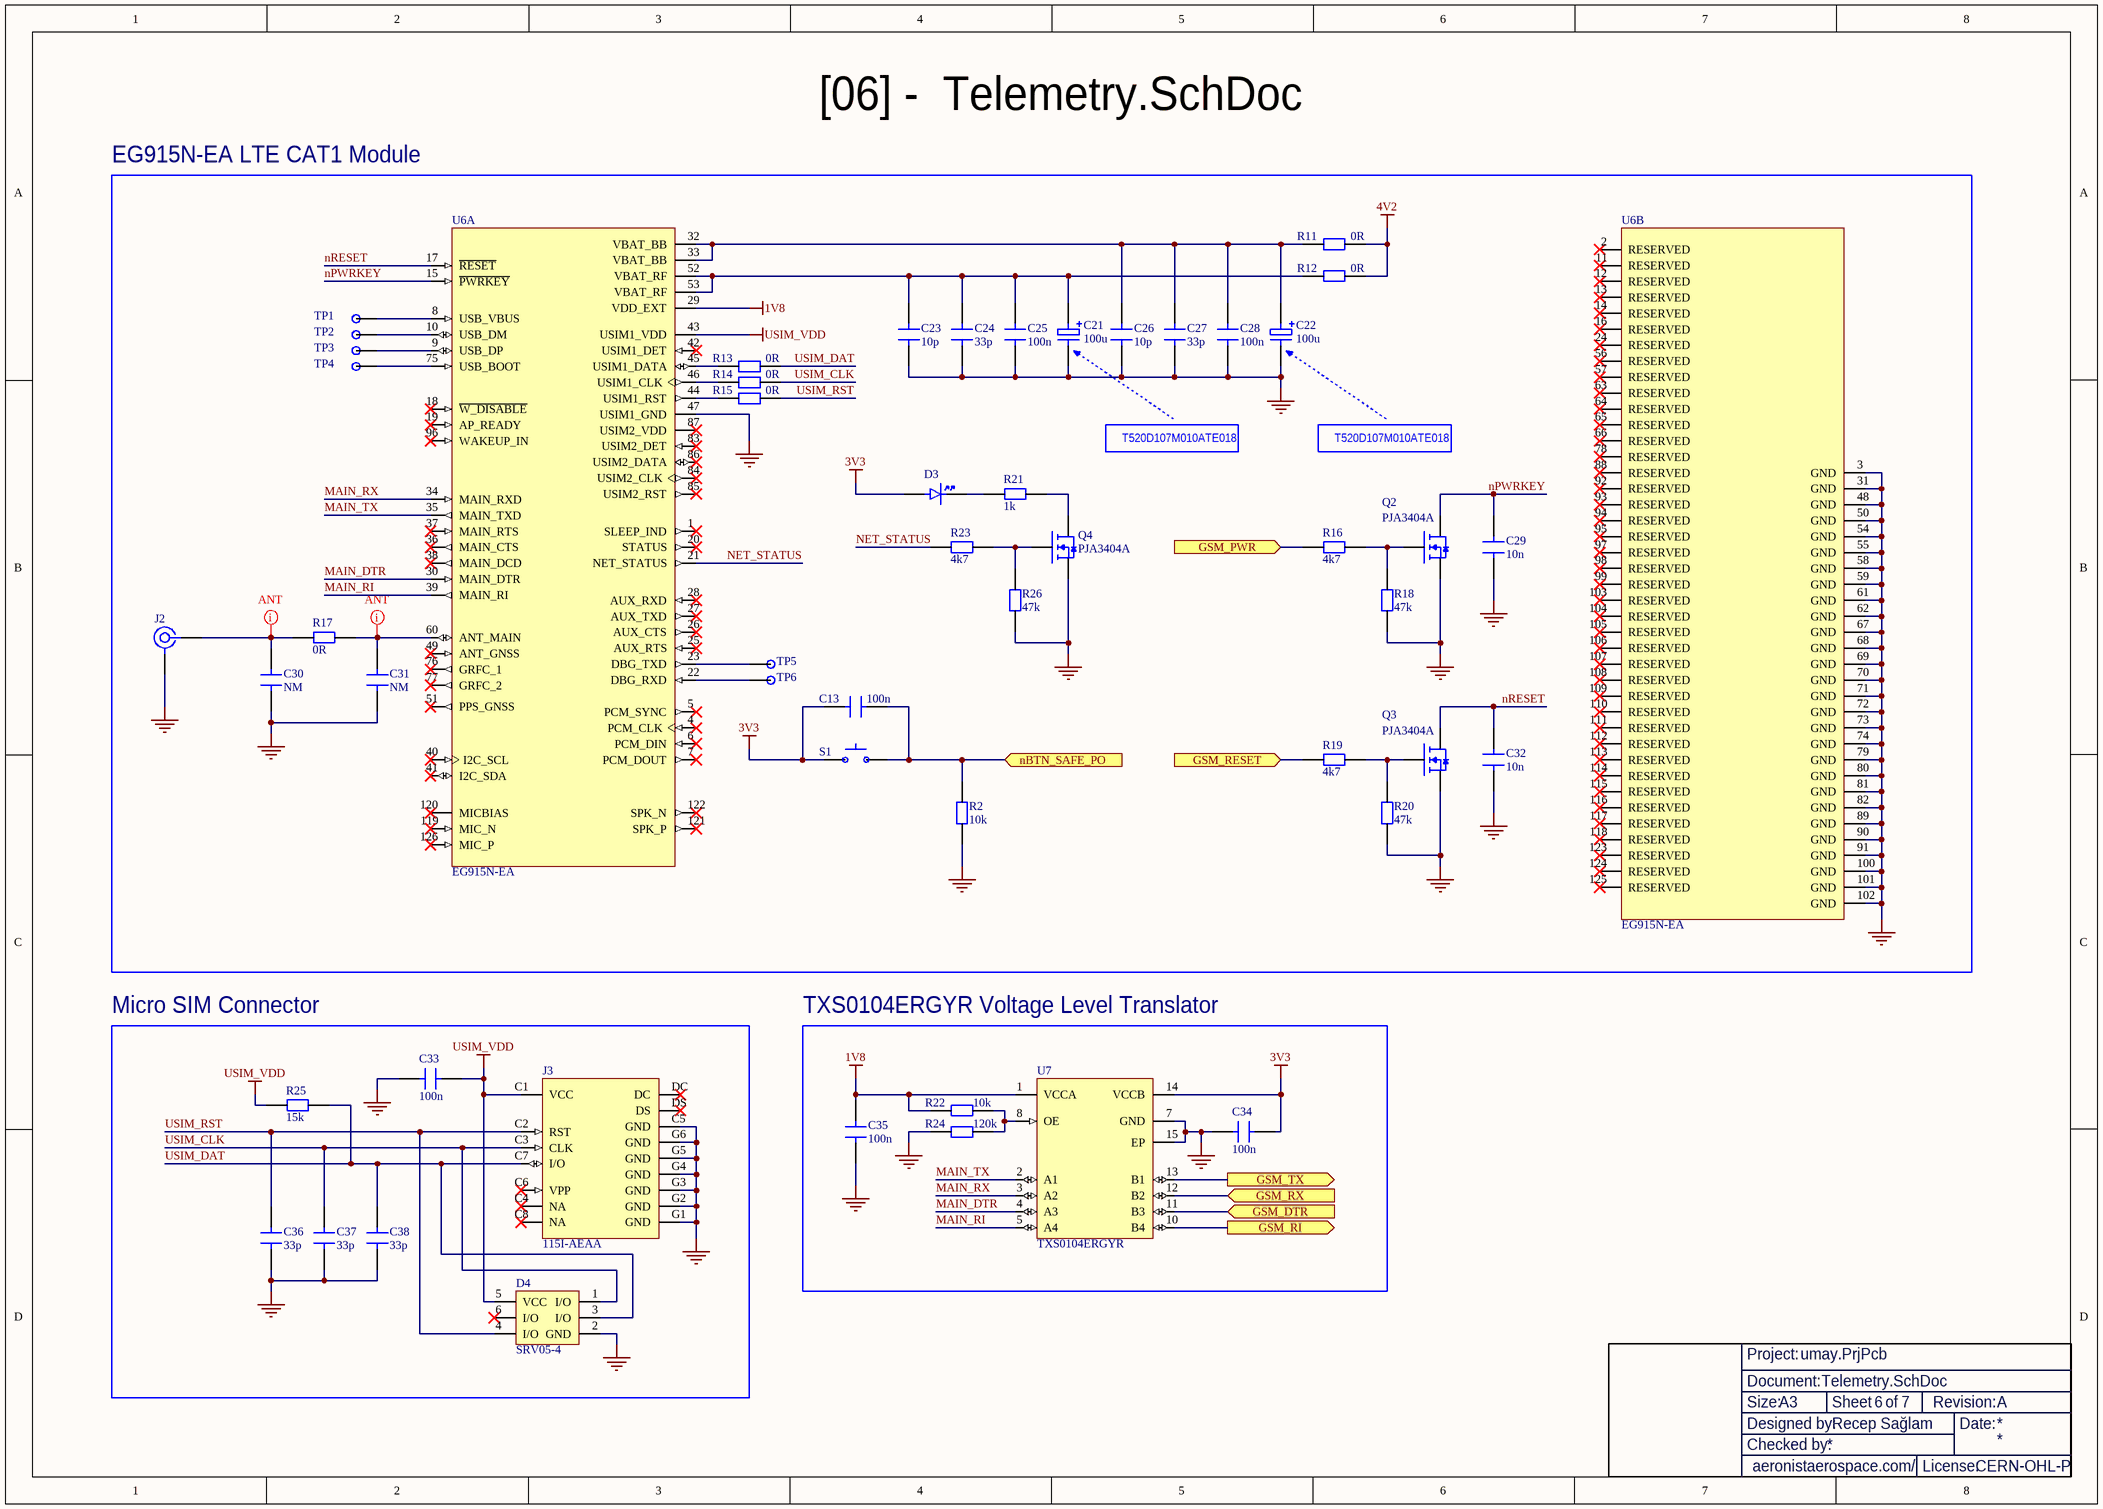
[diagram p4: Telemetry.SchDoc]

### Parts
(Parts that share a designator on the sheet are numbered #1, #2 ... from top to bottom, then left to right.)
?#5  Title Block  (value not drawn)  (graphical)
C13  100n  [CAP 0402]
C21  100u  [CAP TANT D Case]
C22  100u  [CAP TANT D Case]
C23  10p  [CAP 0402]
C24  33p  [CAP 0402]
C25  100n  [CAP 0402]
C26  10p  [CAP 0402]
C27  33p  [CAP 0402]
C28  100n  [CAP 0402]
C29  10n  [CAP 0402]
C30  NM  [CAP 0402]
C31  NM  [CAP 0402]
C32  10n  [CAP 0402]
C33  100n  [CAP 0402]
C34  100n  [CAP 0402]
C35  100n  [CAP 0402]
C36  33p  [CAP 0402]
C37  33p  [CAP 0402]
C38  33p  [CAP 0402]
D3  LED 0805  [LED 0805]  (value not drawn)
D4  SRV05-4  [SOT-23-6]
J2  L-KLS1-SMA-KWE-7X7-15.1  [CONN SMA THT R/A]  (value not drawn)
J3  115I-AEAA  [115I-AEAA]
Q2  PJA3404A  [SOT23-3]
Q3  PJA3404A  [SOT23-3]
Q4  PJA3404A  [SOT23-3]
R2  10k  [RES 0402]
R11  0R  [RES 0805]
R12  0R  [RES 0805]
R13  0R  [RES 0402]
R14  0R  [RES 0402]
R15  0R  [RES 0402]
R16  4k7  [RES 0402]
R17  0R  [RES 0402]
R18  47k  [RES 0402]
R19  4k7  [RES 0402]
R20  47k  [RES 0402]
R21  1k  [RES 0402]
R22  10k  [RES 0402]
R23  4k7  [RES 0402]
R24  120k  [RES 0402]
R25  15k  [RES 0402]
R26  47k  [RES 0402]
S1  SW Tact 4.6x3.2mm  [SW TACT 4.6X3.2MM]  (value not drawn)
TP1  Test Point  [Test Point]  (value not drawn)
TP2  Test Point  [Test Point]  (value not drawn)
TP3  Test Point  [Test Point]  (value not drawn)
TP4  Test Point  [Test Point]  (value not drawn)
TP5  Test Point  [Test Point]  (value not drawn)
TP6  Test Point  [Test Point]  (value not drawn)
U6  EG915N-EA  [EG915N]  (parts A,B of 2)
U7  TXS0104ERGYR  [VQFN-14]

### Blocks framed on the sheet
EG915N-EA LTE CAT1 Module: C13 C21-C32 D3 J2 Q2-Q4 R2 R11-R21 R23 R26 S1 TP1-TP6 U6
Micro SIM Connector: C33 C36-C38 D4 J3 R25
TXS0104ERGYR Voltage Level Translator: C34 C35 R22 R24 U7

### Ports
GSM_DTR (in, see MCU[6C]), GSM_PWR (in, see MCU[6C]), GSM_RESET (in, see MCU[6C]), GSM_RI (out, see MCU[6C]), GSM_RX (in, see MCU[6C]), GSM_TX (out, see MCU[6C]), nBTN_SAFE_PO (in, see MCU[4C])

### Nets
1V8: C35.1 R22.2 U6.29(VDD_EXT) U7.1(VCCA)
3V3: C13.2 C34.1 D3.A S1.4 U7.14(VCCB)
4V2: R11.2 R12.2
GND: C21.2 C22.2 C23.1 C24.1 C25.1 C26.1 C27.1 C28.1 C29.1 C30.2 C31.2 C32.1 C33.2 C34.2 C35.2 C36.2 C37.2 C38.2 D4.2(GND) J2.2 J3.C5(GND) J3.G1(GND) J3.G2(GND) J3.G3(GND) J3.G4(GND) J3.G5(GND) J3.G6(GND) Q2.2(S) Q3.2(S) Q4.2(S) R2.2 R18.2 R20.2 R24.1 R26.2 U6.3(GND) U6.31(GND) U6.47(USIM1_GND) U6.48(GND) U6.50(GND) U6.54(GND) U6.55(GND) U6.58(GND) U6.59(GND) U6.61(GND) U6.62(GND) U6.67(GND) U6.68(GND) U6.69(GND) U6.70(GND) U6.71(GND) U6.72(GND) U6.73(GND) U6.74(GND) U6.79(GND) U6.80(GND) U6.81(GND) U6.82(GND) U6.89(GND) U6.90(GND) U6.91(GND) U6.100(GND) U6.101(GND) U6.102(GND) U7.7(GND) U7.15(EP)
USIM_VDD: C33.1 D4.5(VCC) J3.C1(VCC) R25.1 U6.43(USIM1_VDD)
GPIO_EXTI4: U7.10(B4) ; port GSM_RI
MAIN_DTR: U6.30(MAIN_DTR) U7.4(A3)
MAIN_RI: U6.39(MAIN_RI) U7.5(A4)
MAIN_RX: U6.34(MAIN_RXD) U7.3(A2)
MAIN_TX: U6.35(MAIN_TXD) U7.2(A1)
NET_STATUS: R23.2 U6.21(NET_STATUS)
nPWRKEY: C29.2 Q2.3(D) U6.15(~{PWRKEY})
nRESET: C32.2 Q3.3(D) U6.17(~{RESET})
UART1_RX: U7.13(B1) ; port GSM_TX
UART1_TX: U7.12(B2) ; port GSM_RX
USIM_CLK: C37.1 D4.1(I/O) J3.C3(CLK) R14.1
USIM_DAT: C38.1 D4.3(I/O) J3.C7(I/O) R13.1 R25.2
USIM_RST: C36.1 D4.4(I/O) J3.C2(RST) R15.1
NetC13_1: C13.1 R2.1 S1.2 ; port nBTN_SAFE_PO
NetC21_1: C21.1 C23.2 C24.2 C25.2 R12.1 U6.52(VBAT_RF) U6.53(VBAT_RF)
NetC22_1: C22.1 C26.2 C27.2 C28.2 R11.1 U6.32(VBAT_BB) U6.33(VBAT_BB)
NetC30_1: C30.1 J2.1 R17.1
NetC31_1: C31.1 R17.2 U6.60(ANT_MAIN)
NetD3_K: D3.K R21.1
NetQ2_1: Q2.1(G) R16.1 R18.1
NetQ3_1: Q3.1(G) R19.1 R20.1
NetQ4_1: Q4.1(G) R23.1 R26.1
NetQ4_3: Q4.3(D) R21.2
NetR13_2: R13.2 U6.45(USIM1_DATA)
NetR14_2: R14.2 U6.46(USIM1_CLK)
NetR15_2: R15.2 U6.44(USIM1_RST)
NetR16_2: R16.2 ; port GSM_PWR
NetR19_2: R19.2 ; port GSM_RESET
NetR22_1: R22.1 R24.2 U7.8(OE)
NetTP1_TP: TP1.TP U6.8(USB_VBUS)
NetTP2_TP: TP2.TP U6.10(USB_DM)
NetTP3_TP: TP3.TP U6.9(USB_DP)
NetTP4_TP: TP4.TP U6.75(USB_BOOT)
NetTP5_TP: TP5.TP U6.23(DBG_TXD)
NetTP6_TP: TP6.TP U6.22(DBG_RXD)
NetU1_41: U7.11(B3) ; port GSM_DTR

Not connected (* = marked no-connect by the designer): D4 6(I/O)*; J3 C4(NA)* C6(VPP)* C8(NA)* DC* DS*; U6 1(SLEEP_IND)* 2(RESERVED)* 4(PCM_CLK)* 5(PCM_SYNC)* 6(PCM_DIN)* 7(PCM_DOUT)* 11(RESERVED)* 12(RESERVED)* 13(RESERVED)* 14(RESERVED)* 16(RESERVED)* 18(~{W_DISABLE})* 19(AP_READY)* 20(STATUS)* 24(RESERVED)* 25(AUX_RTS)* 26(AUX_CTS)* 27(AUX_TXD)* 28(AUX_RXD)* 36(MAIN_CTS)* 37(MAIN_RTS)* 38(MAIN_DCD)* 40(I2C_SCL)* 41(I2C_SDA)* 42(USIM1_DET)* 49(ANT_GNSS)* 51(PPS_GNSS)* 56(RESERVED)* 57(RESERVED)* 63(RESERVED)* 64(RESERVED)* 65(RESERVED)* 66(RESERVED)* 76(GRFC_1)* 77(GRFC_2)* 78(RESERVED)* 83(USIM2_DET)* 84(USIM2_CLK)* 85(USIM2_RST)* 86(USIM2_DATA)* 87(USIM2_VDD)* 88(RESERVED)* 92(RESERVED)* 93(RESERVED)* 94(RESERVED)* 95(RESERVED)* 96(WAKEUP_IN)* 97(RESERVED)* 98(RESERVED)* 99(RESERVED)* 103(RESERVED)* 104(RESERVED)* 105(RESERVED)* 106(RESERVED)* 107(RESERVED)* 108(RESERVED)* 109(RESERVED)* 110(RESERVED)* 111(RESERVED)* 112(RESERVED)* 113(RESERVED)* 114(RESERVED)* 115(RESERVED)* 116(RESERVED)* 117(RESERVED)* 118(RESERVED)* 119(MIC_N)* 120(MICBIAS)* 121(SPK_P)* 122(SPK_N)* 123(RESERVED)* 124(RESERVED)* 125(RESERVED)* 126(MIC_P)*

### Layout directives
net class ANT: NetC30_1, NetC31_1

### Notes on the sheet
- [06] -  Telemetry.SchDoc
- T520D107M010ATE018
- (in symbol Title Block) Project:; Document:; Size:; Sheet; of; Revision:; Designed by:; Date:; Checked by:; aeronistaerospace.com/; License:

### Library data of the parts
C13 C23-C38 = CAP 0402: Capacitor SMD 0402
C21 C22 = CAP TANT D Case: Capacitor Tantalum SMD D Case
D3 = LED 0805: LED 0805 SMD
D4 = SRV05-4: SRV Series 17.5 V 3 pF SMT RailClamp® Low Capacitance TVS Diode Array SOT-23-6; Manufacturer: Semtech; Manufacturer Part Number: SRV05-4.TCT; Breakdown Voltage: 6V; Value: 5pF; Clamping Voltage: 12.5V; Current: 5A; Direction: Unidirectional; ESD Protection: Yes; Leakage Current: 5µA; Max Power Dissipation: 300W; Number of Bidirectional Channels: 4; Number of Elements: 1; Operating Supply Voltage: 5V; Peak Pulse Current: 12A; Test Current: 1mA; Supplier: Arrow Electronics; Supplier Part Number: SRV05-4.TCT; RoHS: Compliant; Category: TVS Diodes; Stock: 1665000; Pricing: 3000=0,3492 (USD); Case/Package: SOT-23; China RoHS: Compliant; Depth: 1.6mm; Height: 1.15mm; Lead Free: Lead Free; Length: 2.9mm; Lifecycle Status: Production; Max Breakdown Voltage: 6V; Max Operating Temperature: 125°C; Max Reverse Leakage Current: 5µA; Min Breakdown Voltage: 6V; Min Operating Temperature: -55°C; Mounting Technology: Surface Mount; Number of Channels: 4; Pins: 6; Number of Terminals: 6; Packaging: Cut Tape; Peak Pulse Power: 300W; Polarity: Unidirectional; Power Line Protection: Yes; Power Rating: 300W; Radiation Hardening: No; REACH SVHC: Yes; Reverse Breakdown Voltage: 6V; Reverse Standoff Voltage: 5V; Schedule B: 8542390000, 8542390000|8542390000|8542390000|8542390000|8542390000; Voltage: 5V; Voltage Rating (DC): 5V; Width: 1.6mm; Working Voltage: 5V; ComponentLink1URL: https://datasheet.octopart.com:443/SRV05-4.TCT-Semtech-datasheet-33008608.pdf?src-supplier=IHS; ComponentLink1Description: https://datasheet.octopart.com:443/SRV05-4.TCT-Semtech-datasheet-33008608.pdf?src-supplier=IHS; ComponentLink2URL: https://datasheet.octopart.com:443/SRV05-4.TCT-Semtech-datasheet-604703.pdf?src-supplier=Arrow+Electronics; ComponentLink2Description: https://datasheet.octopart.com:443/SRV05-4.TCT-Semtech-datasheet-604703.pdf?src-supplier=Arrow+Electronics; ComponentLink3URL: https://datasheet.octopart.com:443/SRV05-4.TCT-Semtech-datasheet-41194810.pdf?src-supplier=TME; ComponentLink3Description: https://datasheet.octopart.com:443/SRV05-4.TCT-Semtech-datasheet-41194810.pdf?src-supplier=TME; ComponentLink4URL: https://datasheet.octopart.com:443/SRV05-4.TCT-Semtech-datasheet-10542293.pdf?src-supplier=Farnell; ComponentLink4Description: https://datasheet.octopart.com:443/SRV05-4.TCT-Semtech-datasheet-10542293.pdf?src-supplier=Farnell; ComponentLink5URL: https://datasheet.octopart.com:443/SRV05-4.TCT-Semtech-datasheet-14048601.pdf?src-supplier=iiiC; ComponentLink5Description: https://datasheet.octopart.com:443/SRV05-4.TCT-Semtech-datasheet-14048601.pdf?src-supplier=iiiC
J2 = CONN SMA THT R/A: RF SMA Connector, 1 Contact(s), Board Mount, R/A
J3 = 115I-AEAA: 115I-AEAA Connector Micro SIM Card Push-Pull 6P SMD Card Edge Connectors
Q2-Q4 = MOSFET N-CH: SOT-23-3 package, N-Channel MOSFET
R2 R13-R26 = RES 0402: Resistor SMD 0402
R11 R12 = RES 0805: Resistor SMD 0805
S1 = SW Tact 4.6x3.2mm: 4.6×3.2 mm tactile push-button switch, SPST, momentary, SMD.
TP1-TP6 = Test Point: Test Point, PCB Pad Only, Ø1.2mm
U6 = EG915N-EA: Cellular, Navigation BeiDou, EDGE, Galileo, GLONASS, GNSS, GPRS, GPS, GSM, HSPA+, LTE, UMTS, WCDMA Transceiver Module 915MHz Antenna Not Included Surface Mount; MF: Quectel; MP: EG915NEAAC-N05-SNNSA; SnapEDA_Link: https://www.snapeda.com/parts/EG915NEAAC-N05-SNNSA/Quectel/view-part/?ref=snap; Package: None; Value: *; Check_prices: https://www.snapeda.com/parts/EG915NEAAC-N05-SNNSA/Quectel/view-part/?ref=eda
U7 = TXS0104ERGYR: Four-bit bidirectional voltage-level shifter for open-drain and push-pull applications 14-VQFN -40 to 85; Manufacturer: Texas Instruments; Manufacturer Lifecycle Status: ACTIVE; Data Rate: 24mbps; High Level Output Current: -20µA; Logic Function: Translator; Low Level Output Current: 1mA; Max Junction Temperature (Tj): 150°C; Max Supply Voltage: 5.5V; Min Supply Voltage: 1.65V; Number of Bits: 4; Number of Outputs: 1; Propagation Delay: 260ns; Quiescent Current: 14.4µA; Supplier: Mouser; Supplier Part Number: 595-TXS0104ERGYR; Manufacturer Part Number: TXS0104ERGYR; RoHS: Compliant; Category: Voltage Level Shifters; Stock: 2192; Pricing: 1=1,75, 10=1,12, 50=1, 100=0,824, 1000=0,572, 10000=0,477 (USD); Ambient Temperature Range High: 85°C; Case/Package: VQFN; Height: 1mm; Lead Free: Lead Free; Length: 3.5mm; Lifecycle Status: Production; Max Operating Temperature: 85°C; Min Operating Temperature: -40°C; Mounting Technology: Surface Mount; Number of Channels: 4; Number of Circuits: 4; Number of Inputs: 4; Pins: 14; Output Type: Voltage; Radiation Hardening: No; REACH SVHC: No; Schedule B: 8542390000, 8542390000|8542390000|8542390000|8542390000|8542390000; Termination: SMD/SMT; Thickness: 900µm; Topology: Push-Pull; Turn-On Delay Time: 260ns; Weight: 32.205058mg; Width: 3.5mm; ComponentLink1URL: https://sigma.octopart.com:443/183889324/technical_drawing/Texas-Instruments-TXS0104ERGYR.pdf?src-supplier=Texas+Instruments; ComponentLink1Description: https://sigma.octopart.com:443/183889324/technical_drawing/Texas-Instruments-TXS0104ERGYR.pdf?src-supplier=Texas+Instruments; ComponentLink2URL: https://octopart.com:443/opatz8j6/c1?t=xVBGTrUMwakIB2VMHsXsxFUFoPPT116Fsct1EWR9IwfXtqfzdT-xgAxW5td2RsbUlxN5IpaEpB4BuRdG8tMDFxpQIH58bRCAg85QcnzMA2iX5Assfic2EhPQupKuLb_cOTMFWPcXTxS2FUOoAhYOK1w-GfJlQcIkMH9-B3PKcGFJzuVIUGJVi6wZN00izmAKVlwLJHwpRzhvGfN5ZsevnHBOdT1f977CqvXWcq1EqP2cdaj__zsiItfH1PHfS6TsDAssu1BPNBol1VPjq_1IDPaqyAgjdLA9OBhVf2YXS4dAW6zVEFWevrINt7e5qdo0VTMiHp_a4jdlpT7TaxEF9CWdjquLYdVJ0c4eakITkpijkklV4FFSG-75YO-DnXU4D48feA&src-supplier=Texas+Instruments; ComponentLink2Description: https://octopart.com:443/opatz8j6/c1?t=xVBGTrUMwakIB2VMHsXsxFUFoPPT116Fsct1EWR9IwfXtqfzdT-xgAxW5td2RsbUlxN5IpaEpB4BuRdG8tMDFxpQIH58bRCAg85QcnzMA2iX5Assfic2EhPQupKuLb_cOTMFWPcXTxS2FUOoAhYOK1w-GfJlQcIkMH9-B3PKcGFJzuVIUGJVi6wZN00izmAKVlwLJHwpRzhvGfN5ZsevnHBOdT1f977CqvXWcq1EqP2cdaj__zsiItfH1PHfS6TsDAssu1BPNBol1VPjq_1IDPaqyAgjdLA9OBhVf2YXS4dAW6zVEFWevrINt7e5qdo0VTMiHp_a4jdlpT7TaxEF9CWdjquLYdVJ0c4eakITkpijkklV4FFSG-75YO-DnXU4D48feA&src-supplier=Texas+Instruments; ComponentLink3URL: https://datasheet.octopart.com:443/TXS0104ERGYR-Texas-Instruments-datasheet-17423550.pdf?src-supplier=Texas+Instruments; ComponentLink3Description: https://datasheet.octopart.com:443/TXS0104ERGYR-Texas-Instruments-datasheet-17423550.pdf?src-supplier=Texas+Instruments; ComponentLink4URL: https://datasheet.octopart.com:443/TXS0104ERGYR-Texas-Instruments-datasheet-10254998.pdf?src-supplier=Texas+Instruments; ComponentLink4Description: https://datasheet.octopart.com:443/TXS0104ERGYR-Texas-Instruments-datasheet-10254998.pdf?src-supplier=Texas+Instruments; ComponentLink5URL: https://sigma.octopart.com:443/49249952/technical_drawing/Texas-Instruments-TXS0104ERGYR.pdf?src-supplier=Texas+Instruments; ComponentLink5Description: https://sigma.octopart.com:443/49249952/technical_drawing/Texas-Instruments-TXS0104ERGYR.pdf?src-supplier=Texas+Instruments; ComponentLink6URL: https://datasheet.octopart.com:443/TXS0104ERGYR-Texas-Instruments-datasheet-151984.pdf?src-supplier=Texas+Instruments; ComponentLink6Description: https://datasheet.octopart.com:443/TXS0104ERGYR-Texas-Instruments-datasheet-151984.pdf?src-supplier=Texas+Instruments; ComponentLink7URL: https://datasheet.octopart.com:443/TXS0104ERGYR-Texas-Instruments-datasheet-34148596.pdf?src-supplier=Farnell; ComponentLink7Description: https://datasheet.octopart.com:443/TXS0104ERGYR-Texas-Instruments-datasheet-34148596.pdf?src-supplier=Farnell; ComponentLink8URL: https://datasheet.octopart.com:443/TXS0104ERGYR-Texas-Instruments-datasheet-66618006.pdf?src-supplier=Farnell; ComponentLink8Description: https://datasheet.octopart.com:443/TXS0104ERGYR-Texas-Instruments-datasheet-66618006.pdf?src-supplier=Farnell; ComponentLink9URL: https://datasheet.octopart.com:443/TXS0104ERGYR-Texas-Instruments-datasheet-48033022.pdf?src-supplier=Farnell; ComponentLink9Description: https://datasheet.octopart.com:443/TXS0104ERGYR-Texas-Instruments-datasheet-48033022.pdf?src-supplier=Farnell; ComponentLink10URL: https://datasheet.octopart.com:443/TXS0104ERGYR-Texas-Instruments-datasheet-17023331.pdf?src-supplier=Farnell; ComponentLink10Description: https://datasheet.octopart.com:443/TXS0104ERGYR-Texas-Instruments-datasheet-17023331.pdf?src-supplier=Farnell; ComponentLink11URL: https://datasheet.octopart.com:443/TXS0104ERGYR-Texas-Instruments-datasheet-21828336.pdf?src-supplier=Farnell; ComponentLink11Description: https://datasheet.octopart.com:443/TXS0104ERGYR-Texas-Instruments-datasheet-21828336.pdf?src-supplier=Farnell; ComponentLink12URL: https://datasheet.octopart.com:443/TXS0104ERGYR-Texas-Instruments-datasheet-164421215.pdf?src-supplier=SHENGYU+ELECTRONICS; ComponentLink12Description: https://datasheet.octopart.com:443/TXS0104ERGYR-Texas-Instruments-datasheet-164421215.pdf?src-supplier=SHENGYU+ELECTRONICS; ComponentLink13URL: https://datasheet.octopart.com:443/TXS0104ERGYR-Texas-Instruments-datasheet-165804952.pdf?src-supplier=LCSC; ComponentLink13Description: https://datasheet.octopart.com:443/TXS0104ERGYR-Texas-Instruments-datasheet-165804952.pdf?src-supplier=LCSC; ComponentLink14URL: https://datasheet.octopart.com:443/TXS0104ERGYR-Texas-Instruments-datasheet-159118389.pdf?src-supplier=LCSC; ComponentLink14Description: https://datasheet.octopart.com:443/TXS0104ERGYR-Texas-Instruments-datasheet-159118389.pdf?src-supplier=LCSC; ComponentLink15URL: https://datasheet.octopart.com:443/TXS0104ERGYR-Texas-Instruments-datasheet-137316104.pdf?src-supplier=Future+Electronics; ComponentLink15Description: https://datasheet.octopart.com:443/TXS0104ERGYR-Texas-Instruments-datasheet-137316104.pdf?src-supplier=Future+Electronics; ComponentLink16URL: https://datasheet.octopart.com:443/TXS0104ERGYR-Texas-Instruments-datasheet-10979038.pdf?src-supplier=Arrow+Electronics; ComponentLink16Description: https://datasheet.octopart.com:443/TXS0104ERGYR-Texas-Instruments-datasheet-10979038.pdf?src-supplier=Arrow+Electronics; ComponentLink17URL: https://datasheet.octopart.com:443/TXS0104ERGYR-Texas-Instruments-datasheet-18313.pdf?src-supplier=DigiKey; ComponentLink17Description: https://datasheet.octopart.com:443/TXS0104ERGYR-Texas-Instruments-datasheet-18313.pdf?src-supplier=DigiKey; ComponentLink18URL: http://sigma.octopart.com:80/reach_statement/Texas-Instruments-company-64.pdf?src-supplier=Compliance+Statements; ComponentLink18Description: http://sigma.octopart.com:80/reach_statement/Texas-Instruments-company-64.pdf?src-supplier=Compliance+Statements; ComponentLink19URL: http://sigma.octopart.com:80/conflict_mineral_statement/Texas-Instruments-company-63.pdf?src-supplier=Compliance+Statements; ComponentLink19Description: http://sigma.octopart.com:80/conflict_mineral_statement/Texas-Instruments-company-63.pdf?src-supplier=Compliance+Statements

## Sheet BlockDiagram.SchDoc
size A3; SheetNumber: 2; SheetTotal: 7
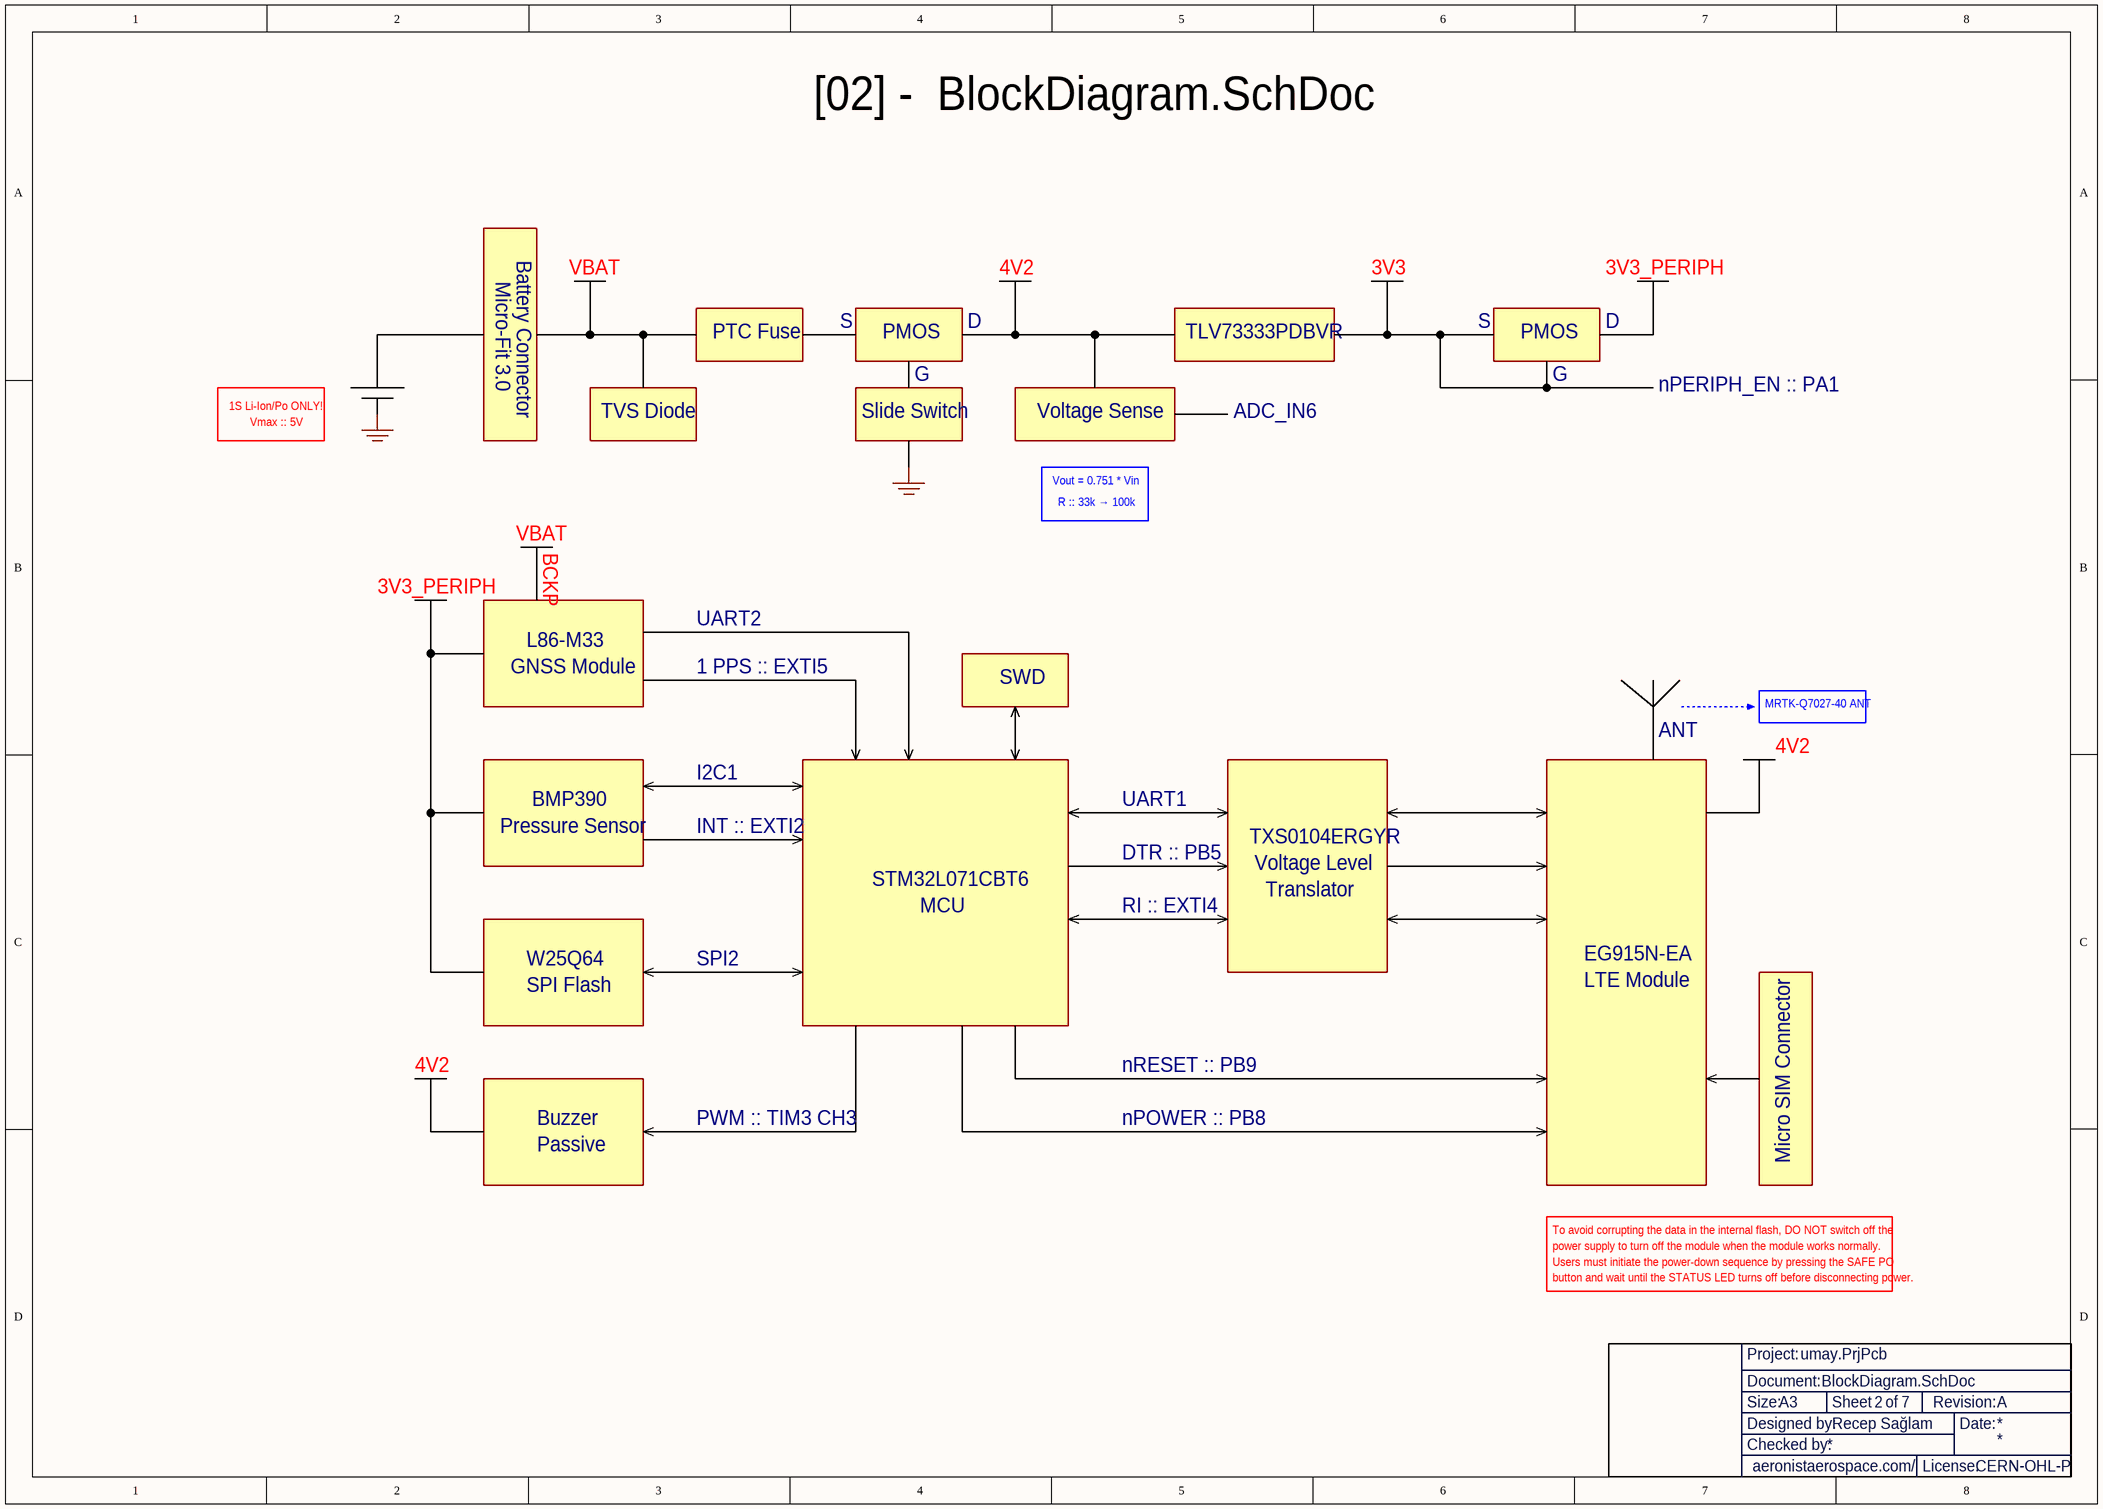
[diagram p5: BlockDiagram.SchDoc]

### Parts
(Parts that share a designator on the sheet are numbered #1, #2 ... from top to bottom, then left to right.)
?#6  Title Block  (value not drawn)  (graphical)

### Notes on the sheet
- [02] -  BlockDiagram.SchDoc
- Micro-Fit 3.0
- Battery Connector
- VBAT
- 4V2
- 3V3
- 3V3_PERIPH
- PTC Fuse
- S
- PMOS
- G
- D
- TLV73333PDBVR
- 1S Li-Ion/Po ONLY!
- Vmax :: 5V
- TVS Diode
- Slide Switch
- Voltage Sense
- ADC_IN6
- nPERIPH_EN :: PA1
- Vout = 0.751 * Vin
- R :: 33k → 100k
- BCKP
- L86-M33
- UART2
- GNSS Module
- 1 PPS :: EXTI5
- SWD
- MRTK-Q7027-40 ANT
- I2C1
- ANT
- Pressure Sensor
- BMP390
- INT :: EXTI2
- UART1
- TXS0104ERGYR
- STM32L071CBT6
- MCU
- DTR :: PB5
- RI :: EXTI4
- Voltage Level
- Translator
- W25Q64
- SPI2
- EG915N-EA
- LTE Module
- SPI Flash
- Buzzer
- PWM :: TIM3 CH3
- nRESET :: PB9
- nPOWER :: PB8
- Passive
- Micro SIM Connector
- To avoid corrupting the data in the internal flash, DO NOT switch off the
- power supply to turn off the module when the module works normally.
- Users must initiate the power-down sequence by pressing the SAFE PO
- button and wait until the STATUS LED turns off before disconnecting power.
- (in symbol Title Block) Project:; Document:; Size:; Sheet; of; Revision:; Designed by:; Date:; Checked by:; aeronistaerospace.com/; License:

## Sheet RevisionHistory.SchDoc
size A3; SheetNumber: 7; SheetTotal: 7
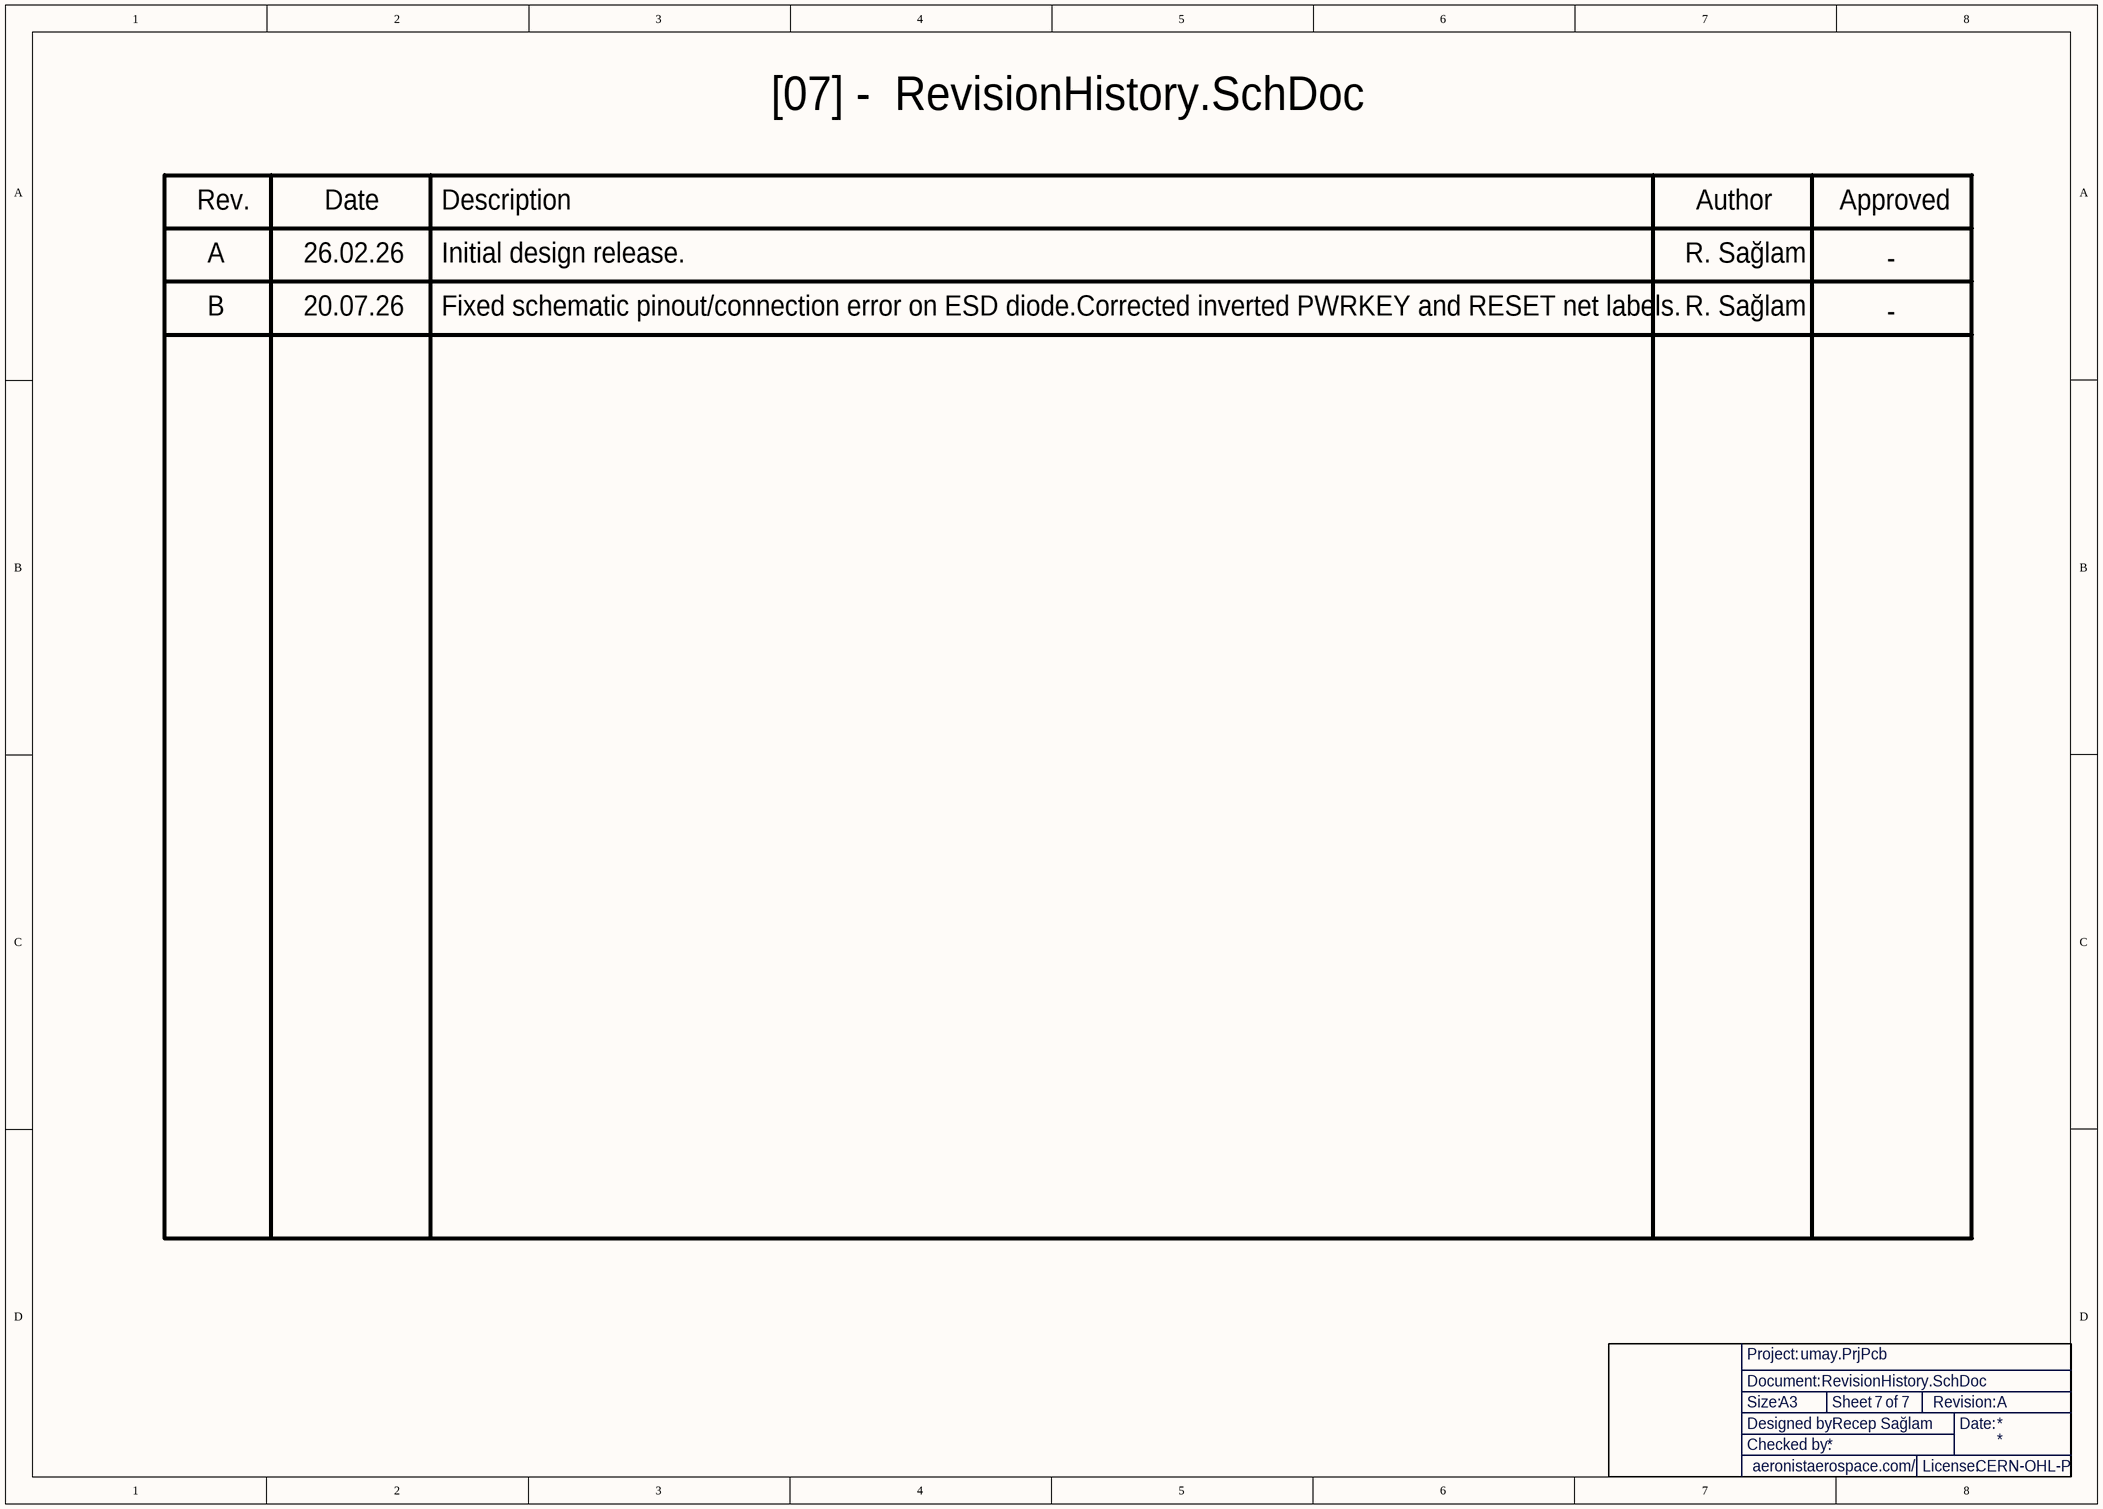
[diagram p6: RevisionHistory.SchDoc]

### Parts
(Parts that share a designator on the sheet are numbered #1, #2 ... from top to bottom, then left to right.)
?#7  Title Block  (value not drawn)  (graphical)

### Notes on the sheet
- [07] -  RevisionHistory.SchDoc
- Rev.
- Date
- Description
- Author
- Approved
- A
- 26.02.26
- Initial design release.
- R. Sağlam
- -
- B
- 20.07.26
- Fixed schematic pinout/connection error on ESD diode.Corrected inverted PWRKEY and RESET net labels.
- (in symbol Title Block) Project:; Document:; Size:; Sheet; of; Revision:; Designed by:; Date:; Checked by:; aeronistaerospace.com/; License:

## Nets that join several sheets
3V3: MCU (11 pins), Power (C41.2 Q5.2 R27.2 U8.5), Telemetry (5 pins)
3V3_PERIPH: Peripherals (15 pins), Power (Q5.3)
4V2: Peripherals (D2.2 U4.+), Power (5 pins), Telemetry (R11.2 R12.2)
GND: MCU (20 pins), Peripherals (17 pins), Power (9 pins), Telemetry (66 pins)
VBAT: Peripherals (C16.2 C17.2 U2.5), Power (C39.2 F1.2 Q6.2 R29.2)
ADC_IN6: MCU (U1.16), Power (C42.2 R30.1 R31.2)
GNSS_PPS: MCU (U1.15), Peripherals (D1.A U2.6)
GPIO_EXTI2: MCU (U1.20), Peripherals (U3.7)
GPIO_EXTI4: MCU (U1.40), Telemetry (U7.10)
I2C1_SCL: MCU (U1.30), Peripherals (R3.1 U3.2)
I2C1_SDA: MCU (U1.31), Peripherals (R4.1 U3.4)
NetC13_1: MCU (U1.38), Telemetry (C13.1 R2.1 S1.2)
NetR7_2: MCU (U1.18), Peripherals (R7.2)
NetR16_2: MCU (U1.45), Telemetry (R16.2)
NetR19_2: MCU (U1.46), Telemetry (R19.2)
NetR28_1: MCU (U1.11), Power (R28.1)
NetU1_41: MCU (U1.41), Telemetry (U7.11)
SPI2_CLK: MCU (U1.26), Peripherals (U5.6)
SPI2_CS: MCU (U1.25), Peripherals (R6.2 U5.1)
SPI2_MISO: MCU (U1.27), Peripherals (U5.2)
SPI2_MOSI: MCU (U1.28), Peripherals (U5.5)
UART1_RX: MCU (U1.43), Telemetry (U7.13)
UART1_TX: MCU (U1.42), Telemetry (U7.12)
UART2_RX: MCU (U1.13), Peripherals (U2.2)
UART2_TX: MCU (U1.12), Peripherals (U2.1)